# Altium project ADCS_Prototype.PrjPcb (part 1 of 2)
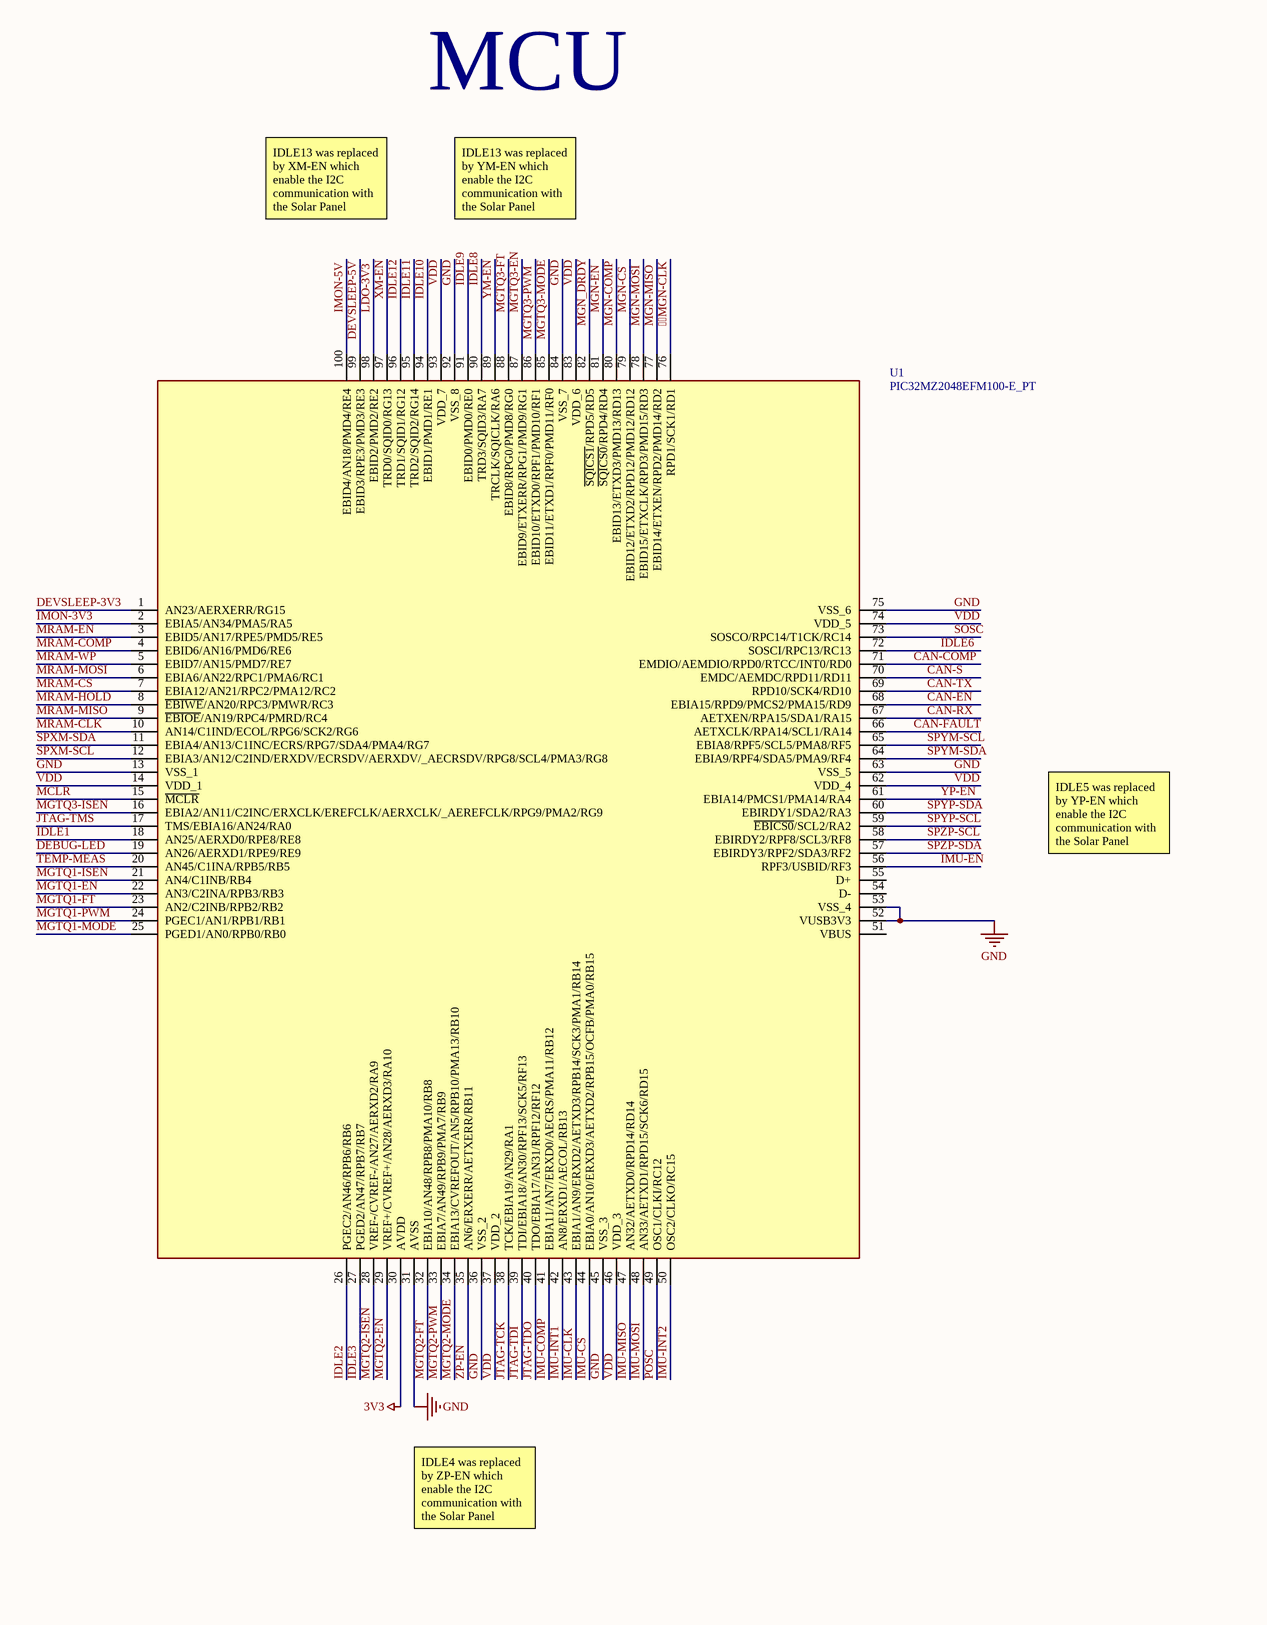
[diagram p0: Complete circuit.SchDoc, left]
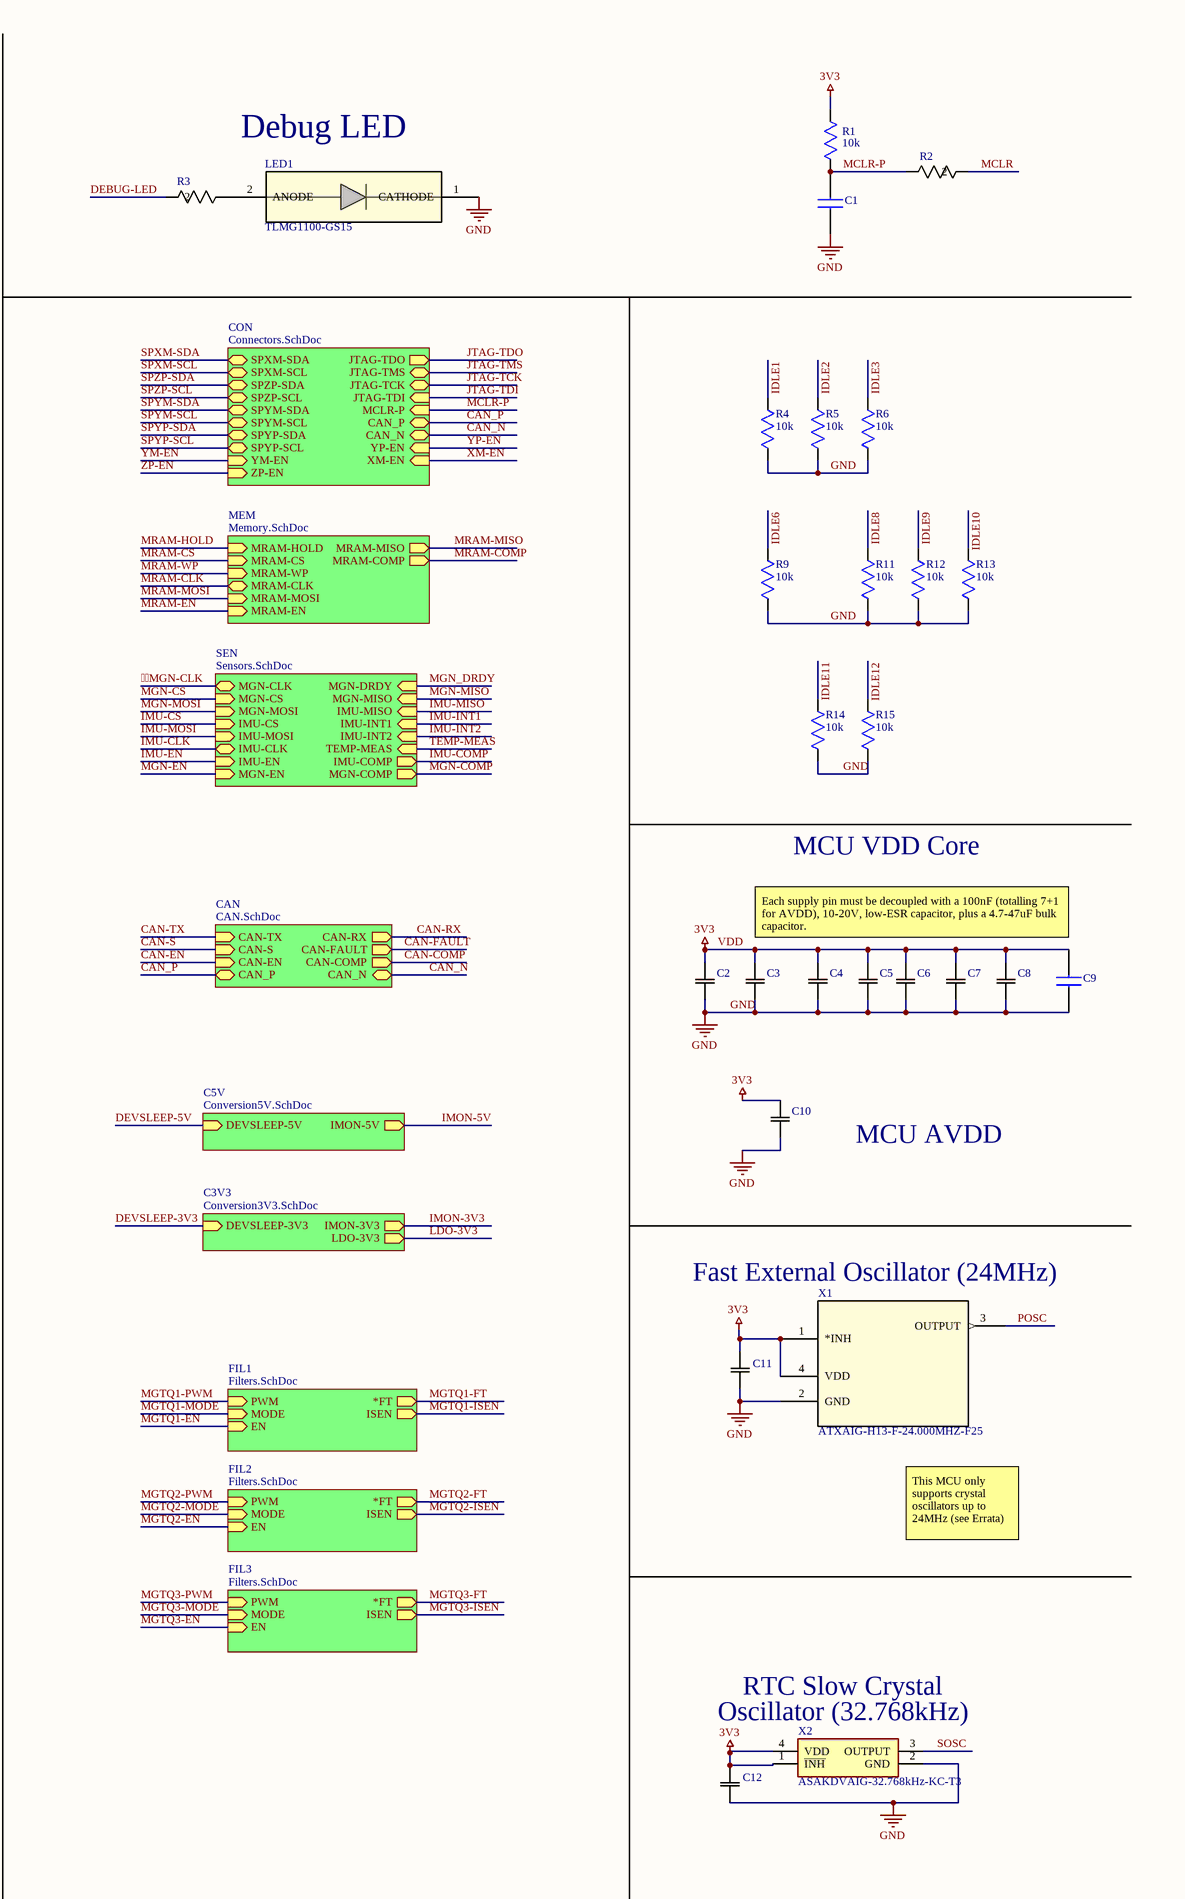
[diagram p1: Complete circuit.SchDoc, right]
9 sheets, 251 parts. Net scope: hierarchical (ports join the sheet entries above them; power ports are global).
Board file: Control_Board.PcbDoc
Sheets:
  Complete circuit.SchDoc
    FIL1 = Filters.SchDoc
    FIL2 = Filters.SchDoc
    FIL3 = Filters.SchDoc
    CAN = CAN.SchDoc
      CAN-CurrSense = CurrentSensing.SchDoc
    SEN = Sensors.SchDoc
      IMU-CurrSense = CurrentSensing.SchDoc
      MGN-CurrSense = CurrentSensing.SchDoc
    C5V = Conversion5V.SchDoc
    C3V3 = Conversion3V3.SchDoc
    CON = Connectors.SchDoc
    MEM = Memory.SchDoc
      MRAM-CurrSense = CurrentSensing.SchDoc

## Sheet Complete circuit.SchDoc
size A2; SheetNumber: 1; SheetTotal: 9

### Parts
C1  C1206C104K3GACAUTO  [CAPC3216X180N]  (value not drawn)
C2  C1206C104J4GACAUTO  [CAPC340180_180N_KEM]  (value not drawn)
C3  C1206C104J4GACAUTO  [CAPC340180_180N_KEM]  (value not drawn)
C4  C1206C104J4GACAUTO  [CAPC340180_180N_KEM]  (value not drawn)
C5  C1206C104J4GACAUTO  [CAPC340180_180N_KEM]  (value not drawn)
C6  C1206C104J4GACAUTO  [CAPC340180_180N_KEM]  (value not drawn)
C7  C1206C104J4GACAUTO  [CAPC340180_180N_KEM]  (value not drawn)
C8  C1206C104J4GACAUTO  [CAPC340180_180N_KEM]  (value not drawn)
C9  C0805X106K8RACAUTO7210  [CAPC2012X145N]  (value not drawn)
C10  C1206C104J4GACAUTO  [CAPC340180_180N_KEM]  (value not drawn)
C11  C0603X103F3GACAUTO  [CAPC17795_95N_KEM]  (value not drawn)
C12  C0603X103F3GACAUTO  [CAPC17795_95N_KEM]  (value not drawn)
LED1  TLMG1100-GS15  [LED_0603_VIS]
R1  value 10k  [RES_ERA3ARB103V]  (hidden comment: ERA3ARB103V)
R2  CRCW06031K00FKEA  [RES_CRCW_0603]  (value not drawn)
R3  MCT0603MD7502BP100  [RES_MCT_0603_VIS]  (value not drawn)
R4  value 10k  [RES_ERA3ARB103V]  (hidden comment: ERA3ARB103V)
R5  value 10k  [RES_ERA3ARB103V]  (hidden comment: ERA3ARB103V)
R6  value 10k  [RES_ERA3ARB103V]  (hidden comment: ERA3ARB103V)
R9  value 10k  [RES_ERA3ARB103V]  (hidden comment: ERA3ARB103V)
R11  value 10k  [RES_ERA3ARB103V]  (hidden comment: ERA3ARB103V)
R12  value 10k  [RES_ERA3ARB103V]  (hidden comment: ERA3ARB103V)
R13  value 10k  [RES_ERA3ARB103V]  (hidden comment: ERA3ARB103V)
R14  value 10k  [RES_ERA3ARB103V]  (hidden comment: ERA3ARB103V)
R15  value 10k  [RES_ERA3ARB103V]  (hidden comment: ERA3ARB103V)
U1  PIC32MZ2048EFM100-E_PT  [QFP40P1400X1400X120-100N]
X1  ATXAIG-H13-F-24.000MHZ-F25  [OSC4_ATXAIG-H13_ABR]
X2  ASAKDVAIG-32.768kHz-KC-T3  [ASAKDVAIG32768kHzKCT3]

### Sub-sheets
C3V3 = Conversion3V3.SchDoc: DEVSLEEP-3V3 (in), IMON-3V3 (out), LDO-3V3 (out)
C5V = Conversion5V.SchDoc: DEVSLEEP-5V (in), IMON-5V (out)
CAN = CAN.SchDoc: CAN-RX (out), CAN-FAULT (out), CAN-COMP (out), CAN-TX (in), CAN-S (in), CAN-EN (in), CAN_P (bidir), CAN_N (bidir)
CON = Connectors.SchDoc: SPXM-SDA (bidir), SPXM-SCL (bidir), SPZP-SDA (bidir), SPZP-SCL (bidir), SPYM-SDA (bidir), SPYM-SCL (bidir), SPYP-SDA (bidir), SPYP-SCL (bidir), JTAG-TDO (out), JTAG-TMS (bidir), JTAG-TCK (bidir), JTAG-TDI (in), MCLR-P (in), CAN_P (bidir), CAN_N (bidir), YP-EN (in), YM-EN (in), XM-EN (in), ZP-EN (in)
FIL1 = Filters.SchDoc: PWM (in), MODE (in), *FT (out), EN (in), ISEN (out)
FIL2 = Filters.SchDoc: PWM (in), MODE (in), *FT (out), EN (in), ISEN (out)
FIL3 = Filters.SchDoc: PWM (in), MODE (in), *FT (out), EN (in), ISEN (out)
MEM = Memory.SchDoc: MRAM-HOLD (in), MRAM-CS (in), MRAM-WP (in), MRAM-CLK (bidir), MRAM-MISO (out), MRAM-MOSI (in), MRAM-EN (in), MRAM-COMP (out)
SEN = Sensors.SchDoc: MGN-DRDY (in), MGN-CLK (bidir), MGN-MISO (in), MGN-CS (in), MGN-MOSI (in), IMU-MISO (in), IMU-CS (in), IMU-INT1 (in), IMU-MOSI (in), IMU-INT2 (in), IMU-CLK (bidir), TEMP-MEAS (in), IMU-EN (in), IMU-COMP (out), MGN-EN (in), MGN-COMP (out)

### Nets
GND: C1.2 C2.1 C3.1 C4.1 C5.1 C6.1 C7.1 C8.1 C9.1 C10.1 C11.1 C12.1 LED1.1(CATHODE) R4.1 R5.1 R6.1 R9.1 R11.1 R12.1 R13.1 R14.1 R15.1 U1.13(VSS_1) U1.31(AVSS) U1.36(VSS_2) U1.45(VSS_3) U1.52(VUSB3V3) U1.53(VSS_4) U1.63(VSS_5) U1.75(VSS_6) U1.84(VSS_7) U1.92(VSS_8) X1.2(GND) X2.2(GND)
VDD: C2.2 C3.2 C4.2 C5.2 C6.2 C7.2 C8.2 C9.2 C10.2 C11.2 C12.2 R1.2 U1.14(VDD_1) U1.30(AVDD) U1.37(VDD_2) U1.46(VDD_3) U1.62(VDD_4) U1.74(VDD_5) U1.83(VDD_6) U1.93(VDD_7) X1.1(*INH) X1.4(VDD) X2.1(~{INH}) X2.4(VDD)  [also labelled 3V3]
MGN-CLK: U1.76(RPD1/SCK1/RD1) ; sheet SEN/MGN-CLK
CAN-COMP: U1.71(EMDIO/AEMDIO/RPD0/RTCC/INT0/RD0) ; sheet CAN/CAN-COMP
CAN-EN: U1.68(EBIA15/RPD9/PMCS2/PMA15/RD9) ; sheet CAN/CAN-EN
CAN-FAULT: U1.66(AETXCLK/RPA14/SCL1/RA14) ; sheet CAN/CAN-FAULT
CAN-RX: U1.67(AETXEN/RPA15/SDA1/RA15) ; sheet CAN/CAN-RX
CAN-S: U1.70(EMDC/AEMDC/RPD11/RD11) ; sheet CAN/CAN-S
CAN-TX: U1.69(RPD10/SCK4/RD10) ; sheet CAN/CAN-TX
CAN_N: sheet CAN/CAN_N, sheet CON/CAN_N
CAN_P: sheet CAN/CAN_P, sheet CON/CAN_P
DEBUG-LED: R3.2 U1.19(AN26/AERXD1/RPE9/RE9)
DEVSLEEP-3V3: U1.1(AN23/AERXERR/RG15) ; sheet C3V3/DEVSLEEP-3V3
DEVSLEEP-5V: U1.99(EBID3/RPE3/PMD3/RE3) ; sheet C5V/DEVSLEEP-5V
IDLE1: R4.2 U1.18(AN25/AERXD0/RPE8/RE8)
IDLE2: R5.2 U1.26(PGEC2/AN46/RPB6/RB6)
IDLE3: R6.2 U1.27(PGED2/AN47/RPB7/RB7)
IDLE6: R9.2 U1.72(SOSCI/RPC13/RC13)
IDLE8: R11.2 U1.90(TRD3/SQID3/RA7)
IDLE9: R12.2 U1.91(EBID0/PMD0/RE0)
IDLE10: R13.2 U1.94(EBID1/PMD1/RE1)
IDLE11: R14.2 U1.95(TRD2/SQID2/RG14)
IDLE12: R15.2 U1.96(TRD1/SQID1/RG12)
IMON-3V3: U1.2(EBIA5/AN34/PMA5/RA5) ; sheet C3V3/IMON-3V3
IMON-5V: U1.100(EBID4/AN18/PMD4/RE4) ; sheet C5V/IMON-5V
IMU-CLK: U1.43(EBIA1/AN9/ERXD2/AETXD3/RPB14/SCK3/PMA1/RB14) ; sheet SEN/IMU-CLK
IMU-COMP: U1.41(EBIA11/AN7/ERXD0/AECRS/PMA11/RB12) ; sheet SEN/IMU-COMP
IMU-CS: U1.44(EBIA0/AN10/ERXD3/AETXD2/RPB15/OCFB/PMA0/RB15) ; sheet SEN/IMU-CS
IMU-EN: U1.56(RPF3/USBID/RF3) ; sheet SEN/IMU-EN
IMU-INT1: U1.42(AN8/ERXD1/AECOL/RB13) ; sheet SEN/IMU-INT1
IMU-INT2: U1.50(OSC2/CLKO/RC15) ; sheet SEN/IMU-INT2
IMU-MISO: U1.47(AN32/AETXD0/RPD14/RD14) ; sheet SEN/IMU-MISO
IMU-MOSI: U1.48(AN33/AETXD1/RPD15/SCK6/RD15) ; sheet SEN/IMU-MOSI
JTAG-TCK: U1.38(TCK/EBIA19/AN29/RA1) ; sheet CON/JTAG-TCK
JTAG-TDI: U1.39(TDI/EBIA18/AN30/RPF13/SCK5/RF13) ; sheet CON/JTAG-TDI
JTAG-TDO: U1.40(TDO/EBIA17/AN31/RPF12/RF12) ; sheet CON/JTAG-TDO
JTAG-TMS: U1.17(TMS/EBIA16/AN24/RA0) ; sheet CON/JTAG-TMS
LDO-3V3: U1.98(EBID2/PMD2/RE2) ; sheet C3V3/LDO-3V3
MCLR: R2.2 U1.15(~{MCLR})
MCLR-P: C1.1 R1.1 R2.1 ; sheet CON/MCLR-P
MGN-COMP: U1.80(EBID13/ETXD3/PMD13/RD13) ; sheet SEN/MGN-COMP
MGN-CS: U1.79(EBID12/ETXD2/RPD12/PMD12/RD12) ; sheet SEN/MGN-CS
MGN-EN: U1.81(~{SQICS0}/RPD4/RD4) ; sheet SEN/MGN-EN
MGN-MISO: U1.77(EBID14/ETXEN/RPD2/PMD14/RD2) ; sheet SEN/MGN-MISO
MGN-MOSI: U1.78(EBID15/ETXCLK/RPD3/PMD15/RD3) ; sheet SEN/MGN-MOSI
MGN_DRDY: U1.82(~{SQICS1}/RPD5/RD5) ; sheet SEN/MGN-DRDY
MGTQ1-EN: U1.22(AN3/C2INA/RPB3/RB3) ; sheet FIL1/EN
MGTQ1-FT: U1.23(AN2/C2INB/RPB2/RB2) ; sheet FIL1/*FT
MGTQ1-ISEN: U1.21(AN4/C1INB/RB4) ; sheet FIL1/ISEN  [project net ISEN_IFB]
MGTQ1-MODE: U1.25(PGED1/AN0/RPB0/RB0) ; sheet FIL1/MODE
MGTQ1-PWM: U1.24(PGEC1/AN1/RPB1/RB1) ; sheet FIL1/PWM
MGTQ2-EN: U1.29(VREF+/CVREF+/AN28/AERXD3/RA10) ; sheet FIL2/EN
MGTQ2-FT: U1.32(EBIA10/AN48/RPB8/PMA10/RB8) ; sheet FIL2/*FT
MGTQ2-ISEN: U1.28(VREF-/CVREF-/AN27/AERXD2/RA9) ; sheet FIL2/ISEN  [project net ISEN_IFB]
MGTQ2-MODE: U1.34(EBIA13/CVREFOUT/AN5/RPB10/PMA13/RB10) ; sheet FIL2/MODE
MGTQ2-PWM: U1.33(EBIA7/AN49/RPB9/PMA7/RB9) ; sheet FIL2/PWM
MGTQ3-EN: U1.87(EBID9/ETXERR/RPG1/PMD9/RG1) ; sheet FIL3/EN
MGTQ3-FT: U1.88(EBID8/RPG0/PMD8/RG0) ; sheet FIL3/*FT
MGTQ3-ISEN: U1.16(EBIA2/AN11/C2INC/ERXCLK/EREFCLK/AERXCLK/_AEREFCLK/RPG9/PMA2/RG9) ; sheet FIL3/ISEN  [project net ISEN_IFB]
MGTQ3-MODE: U1.85(EBID11/ETXD1/RPF0/PMD11/RF0) ; sheet FIL3/MODE
MGTQ3-PWM: U1.86(EBID10/ETXD0/RPF1/PMD10/RF1) ; sheet FIL3/PWM
MRAM-CLK: U1.10(AN14/C1IND/ECOL/RPG6/SCK2/RG6) ; sheet MEM/MRAM-CLK
MRAM-COMP: U1.4(EBID6/AN16/PMD6/RE6) ; sheet MEM/MRAM-COMP
MRAM-CS: U1.7(EBIA12/AN21/RPC2/PMA12/RC2) ; sheet MEM/MRAM-CS
MRAM-EN: U1.3(EBID5/AN17/RPE5/PMD5/RE5) ; sheet MEM/MRAM-EN
MRAM-HOLD: U1.8(~{EBIWE}/AN20/RPC3/PMWR/RC3) ; sheet MEM/MRAM-HOLD
MRAM-MISO: U1.9(~{EBIOE}/AN19/RPC4/PMRD/RC4) ; sheet MEM/MRAM-MISO
MRAM-MOSI: U1.6(EBIA6/AN22/RPC1/PMA6/RC1) ; sheet MEM/MRAM-MOSI
MRAM-WP: U1.5(EBID7/AN15/PMD7/RE7) ; sheet MEM/MRAM-WP
POSC: U1.49(OSC1/CLKI/RC12) X1.3(OUTPUT)
SOSC: U1.73(SOSCO/RPC14/T1CK/RC14) X2.3(OUTPUT)
SPXM-SCL: U1.12(EBIA3/AN12/C2IND/ERXDV/ECRSDV/AERXDV/_AECRSDV/RPG8/SCL4/PMA3/RG8) ; sheet CON/SPXM-SCL
SPXM-SDA: U1.11(EBIA4/AN13/C1INC/ECRS/RPG7/SDA4/PMA4/RG7) ; sheet CON/SPXM-SDA
SPYM-SCL: U1.65(EBIA8/RPF5/SCL5/PMA8/RF5) ; sheet CON/SPYM-SCL
SPYM-SDA: U1.64(EBIA9/RPF4/SDA5/PMA9/RF4) ; sheet CON/SPYM-SDA
SPYP-SCL: U1.59(~{EBICS0}/SCL2/RA2) ; sheet CON/SPYP-SCL
SPYP-SDA: U1.60(EBIRDY1/SDA2/RA3) ; sheet CON/SPYP-SDA
SPZP-SCL: U1.58(EBIRDY2/RPF8/SCL3/RF8) ; sheet CON/SPZP-SCL
SPZP-SDA: U1.57(EBIRDY3/RPF2/SDA3/RF2) ; sheet CON/SPZP-SDA
TEMP-MEAS: U1.20(AN45/C1INA/RPB5/RB5) ; sheet SEN/TEMP-MEAS
XM-EN: U1.97(TRD0/SQID0/RG13) ; sheet CON/XM-EN
YM-EN: U1.89(TRCLK/SQICLK/RA6) ; sheet CON/YM-EN
YP-EN: U1.61(EBIA14/PMCS1/PMA14/RA4) ; sheet CON/YP-EN
ZP-EN: U1.35(AN6/ERXERR/AETXERR/RB11) ; sheet CON/ZP-EN
NetLED1_2: LED1.2(ANODE) R3.1

Not connected (* = marked no-connect by the designer): U1 51(VBUS) 54(D-) 55(D+)

### Notes on the sheet
- Debug LED
- MCU
- IDLE13 was replaced by XM-EN which enable the I2C communication with the Solar Panel
- IDLE13 was replaced by YM-EN which enable the I2C communication with the Solar Panel
- IDLE5 was replaced by YP-EN which enable the I2C communication with the Solar Panel
- MCU VDD Core
- Each supply pin must be decoupled with a 100nF (totalling 7+1 for AVDD), 10-20V, low-ESR capacitor, plus a 4.7-47uF bulk capacitor.
- MCU AVDD
- (near X1) Fast External Oscillator (24MHz)
- IDLE4 was replaced by ZP-EN which enable the I2C communication with the Solar Panel
- This MCU only supports crystal oscillators up to 24MHz (see Errata)
- (near X2) Oscillator (32.768kHz)
- RTC Slow Crystal

### Library data of the parts
C1 = CMP-001-00115-2: SMD Auto C0G, Ceramic, 0.1 uF, 10%, 25 VDC, 62.5 VDC, 125C, -55C, C0G, SMD, MLCC, Ultra-Stable, Low Loss, Automotive Grade, 0.1 % , 10 GOhms, 36 mg, 1206, 3.2mm, 1.6mm, 1.6mm, 0.5mm, 2000, 78  Weeks, 120; Manufacturer_Name: KEMET; Geometry.Height: 1.8mm; Datasheet Link: https://content.kemet.com/datasheets/KEM_C1022_C0G_AUTO_SMD.pdf; Design Item ID: C1206C104K3GACAUTO; Manufacturer_Part_Number: C1206C104K3GACAUTO; Mouser Part Number: 80-C1206C104K3GAUTO; Mouser Price/Stock: https://www.mouser.co.uk/ProductDetail/KEMET/C1206C104K3GACAUTO?qs=iLbezkQI%252BsiL409OZdKKSA%3D%3D; Source: C1206C104K3GACAUTO.SchLib
C2-C8 C10 = CMP-001-00131-4: SMD Auto C0G, Ceramic, 0.1 uF, 5%, 16 VDC, C0G, SMD, MLCC, Ultra-Stable, Low Loss, Automotive Grade, 1206; Manufacturer_Name: Kemet; Copyright: Copyright (C) 2025 Ultra Librarian. All rights reserved.; Manufacturer_Part_Number: C1206C104J4GACAUTO; Source: C1206C104J4GACAUTO.SchLib; Design Item ID: C1206C104J4GACAUTO
C9 = CMP-001-00121-2: SMD Auto X7R Flex, Ceramic, 10 uF, 10%, 10 VDC, 25 VDC, 125C, -55C, X7R, SMD, MLCC, FT-CAP, Automotive Grade, 10 % , 10 MOhms, 21 mg, 0805, 2mm, 1.25mm, 1.25mm, 0.75mm, 0.5mm, 10000, 78  Weeks, 80; Manufacturer_Name: YAGEO; Geometry.Height: 1.45mm; Capacitance: 10uF; Mouser Price/Stock: https://www.mouser.co.uk/ProductDetail/KEMET/C0805X106K8RACAUTO7210?qs=HXFqYaX1Q2whBpVr4Bdd3g%3D%3D; Mouser Part Number: 80-C0805X106K8RAUTLR; Source: C0805X106K8RACAUTO7210.SchLib; Design Item ID: C0805X106K8RACAUTO7210; Datasheet Link: https://content.kemet.com/datasheets/KEM_C1078_X7R_FT-CAP_AUTO_SMD.pdf; Manufacturer_Part_Number: C0805X106K8RACAUTO7210
C11 C12 = CMP-001-00116-2: SMD Auto C0G Flex, Ceramic, 0.01 uF, 1%, 25 VDC, C0G, SMD, MLCC, FT-CAP, Ultra-Stable, Automotive Grade, 0603; Manufacturer_Name: Kemet; Copyright: Copyright (C) 2025 Ultra Librarian. All rights reserved.; Design Item ID: C0603X103F3GACAUTO; Manufacturer_Part_Number: C0603X103F3GACAUTO; Source: C0603X103F3GACAUTO.SchLib
LED1 = CMP-007-00036-1: CHIPLED(SMD 0603-LED) GREEN U.BRIGHT-e4; Manufacturer_Name: Vishay; RefDes: RefDes; Copyright: Copyright (C) 2025 Ultra Librarian. All rights reserved.; Type: Type; Design Item ID: TLMG1100-GS15; Manufacturer_Part_Number: TLMG1100-GS15; Source: TLMG1100-GS15.SchLib
R1 R4-R6 R9 R11-R15 = CMP-009-00245-3: Thin Film Resistors - SMD 0603 10Kohm 0.1% 10ppm AEC-Q200; Design Item ID: ERA3ARB103V; Case/Package: None; Pins: 2; Source: ERA3ARB103V.SchLib; Component Type: Standard; MP: ERA3ARB103V; Availability: Unavailable; Price: None
R2 = CMP-009-00227-2: D11/CRCW0603 100 1K 1% ET1 e3; Manufacturer_Name: Vishay; Source: CRCW06031K00FKEA.SchLib; Copyright: Copyright (C) 2026 Ultra Librarian. All rights reserved.; Design Item ID: CRCW06031K00FKEA; Manufacturer_Part_Number: CRCW06031K00FKEA
R3 = CMP-009-00216-2: MCT 0603-25 0.1% AT P1 75K; Manufacturer_Name: Vishay; Source: MCT0603MD7502BP100.SchLib; Copyright: Copyright (C) 2025 Ultra Librarian. All rights reserved.; Design Item ID: MCT0603MD7502BP100; Manufacturer_Part_Number: MCT0603MD7502BP100
U1 = CMP-481-000000-2: 32-bit Microcontrollers - MCU 32-Bit MCU 2048KB FL 512KB RAM Crypto; Manufacturer_Part_Number: PIC32MZ2048EFM100-E/PT; Manufacturer_Name: Microchip; Geometry.Height: 1.2mm; Source: PIC32MZ2048EFM100-E_PT.SchLib; Mouser Part Number: 579-MZ2048EFM100EPT; Design Item ID: PIC32MZ2048EFM100-E_PT; Datasheet Link: https://componentsearchengine.com/Datasheets/1/PIC32MZ2048EFM100-E_PT.pdf; Mouser Price/Stock: https://www.mouser.co.uk/ProductDetail/Microchip-Technology/PIC32MZ2048EFM100-E-PT?qs=r%2FmwOkjQ8utAqJN2CglPVg%3D%3D
X1 = CMP-337-000000-2: 24 MHz TCXO CMOS Oscillator 1.68V ~ 3.63V Enable/Disable 4-SMD, No Lead; Manufacturer_Name: Abracon; Copyright: Copyright (C) 2026 Ultra Librarian. All rights reserved.; Manufacturer_Part_Number: ATXAIG-H13-F-40.000MHZ-F25; RefDes: RefDes; Source: ATXAIG-H13-F-40P000MHZ-F25.SchLib; Type: Oscillators; Design Item ID: ATXAIG-H13-F-40.000MHZ-F25
X2 = CMP-003-00035-1: XTAL OSC XO Continuous Volt kHz Automotive; Manufacturer_Name: ABRACON; Geometry.Height: 0.8mm; Datasheet Link: https://abracon.com/datasheets/ASAKDVAIG.pdf; Manufacturer_Part_Number: ASAKDVAIG-32.768kHz-KC-T3; Design Item ID: ASAKDVAIG-32.768kHz-KC-T3; Mouser Part Number: 815-AKDVAIG32768KCT3; Source: ASAKDVAIG-32.768kHz-KC-T3.SchLib; Mouser Price/Stock: https://www.mouser.co.uk/ProductDetail/ABRACON/ASAKDVAIG-32.768kHz-KC-T3?qs=vvQtp7zwQdM6CQP0VQ4oog%3D%3D

## Sheet Filters.SchDoc
size A4; SheetNumber: 4; SheetTotal: 9
Used 3 times, as channels FIL1, FIL2, FIL3. Parts and nets are listed once, with the designators drawn on the sheet.
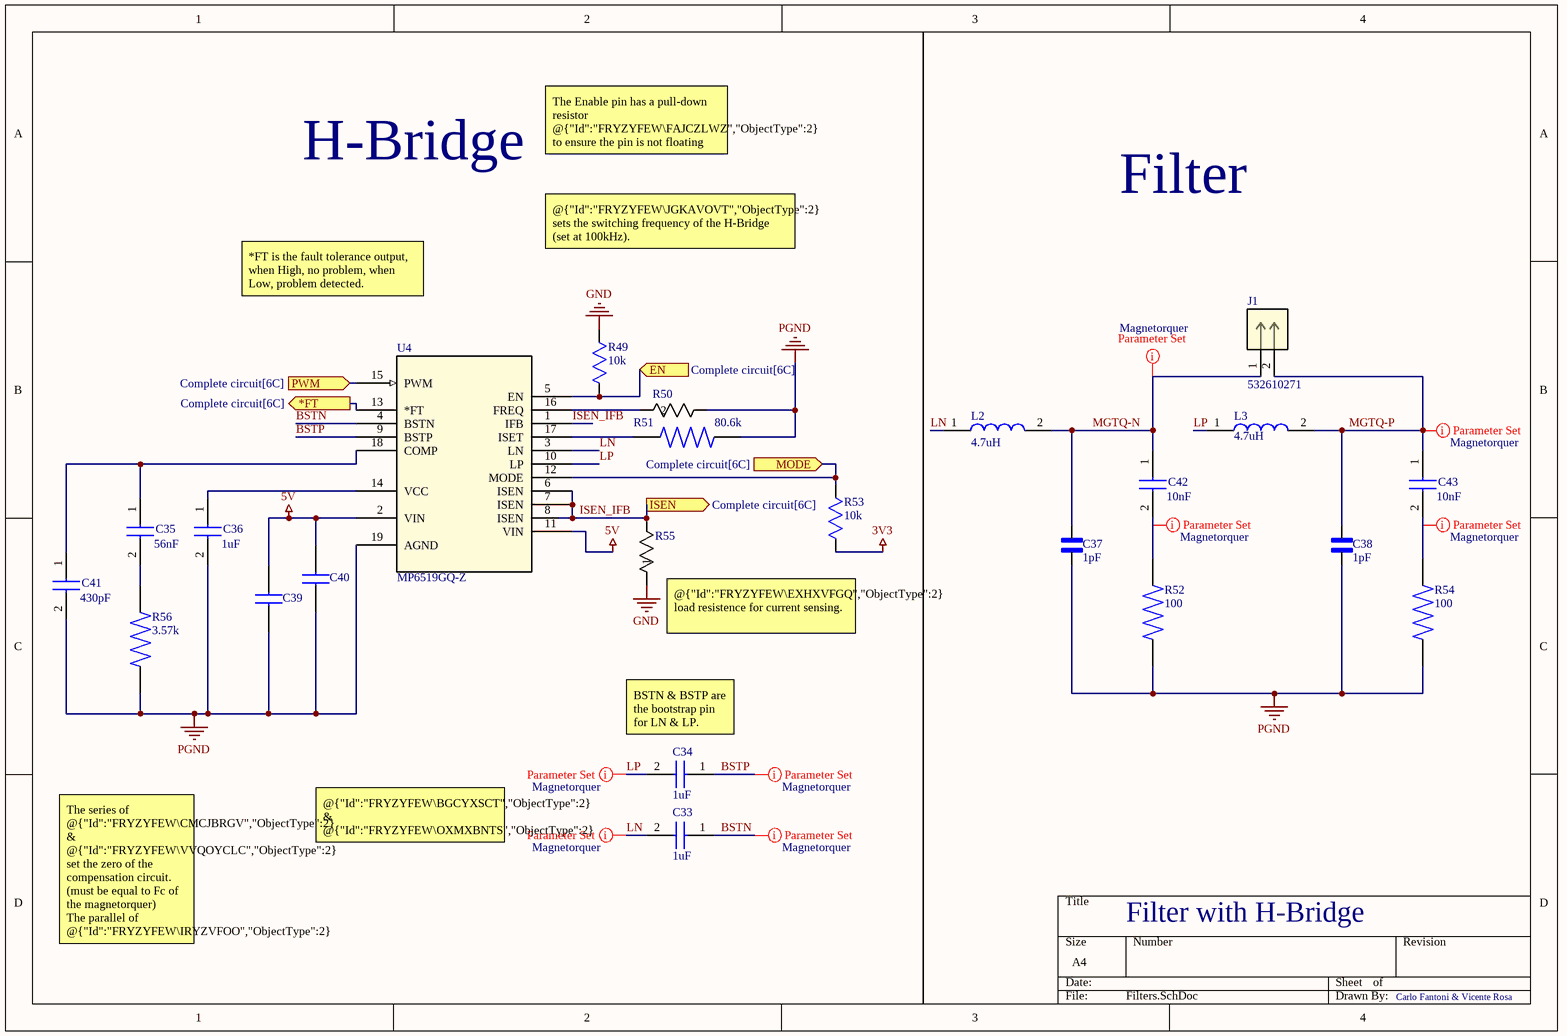
[diagram p2: Filters.SchDoc]

### Parts
C33  Capacitance: 1uF  [C0603]  (hidden comment: C0603X105K4RACAUTO7411)
C34  Capacitance: 1uF  [C0603]  (hidden comment: C0603X105K4RACAUTO7411)
C35  Capacitance: 56nF  [GCM31C5C2E183FX03L]  (hidden comment: GCM31M5C1H563GA16L)
C36  Capacitance: 1uF  [C0603]  (hidden comment: C0603X105K4RACAUTO7411)
C37  value 1pF  [CAPC1608X90]  (hidden comment: AC0603BRNPO9BN1R0)
C38  value 1pF  [CAPC1608X90]  (hidden comment: AC0603BRNPO9BN1R0)
C39  GCM31CR71A226KE02L  [CAPC3116X180N]  (value not drawn)
C40  GCM31CR71A226KE02L  [CAPC3116X180N]  (value not drawn)
C41  Capacitance: 430pF  [CAPC1608X90N]  (hidden comment: 06035C431JAT2A)
C42  Capacitance: 10nF  [CAPC1608X90N]  (hidden comment: 0603ZC103M4T2A)
C43  Capacitance: 10nF  [CAPC1608X90N]  (hidden comment: 0603ZC103M4T2A)
J1  532610271  [CONN_532610001-SD_02_MOL]
L2  Inductance: 4.7uH  [LQM2MPN1R0NG0L]  (hidden comment: LQM2MPZ4R7MG0L)
L3  Inductance: 4.7uH  [LQM2MPN1R0NG0L]  (hidden comment: LQM2MPZ4R7MG0L)
R49  value 10k  [RES_ERA3ARB103V]  (hidden comment: ERA3ARB103V)
R50  ERJ-6ENF2260V  [RC0805N_PAN]  (value not drawn)
R51  value 80.6k  [RES_ERJ3EKF8062V]  (hidden comment: ERJ3EKF8062V)
R52  value 100  [RESC2012X60N]  (hidden comment: CRCW0805100RFKEAHP)
R53  value 10k  [RES_ERA3ARB103V]  (hidden comment: ERA3ARB103V)
R54  value 100  [RESC2012X60N]  (hidden comment: CRCW0805100RFKEAHP)
R55  KDV06FR100ET  [RES_KDV06_OHM]  (value not drawn)
R56  value 3.57k  [RES_ERJPA3F3571V]  (hidden comment: ERJPA3F3571V)
U4  MP6519GQ-Z  [QFN-3x3_MP6519_MNP]

### Ports
*FT (out, see Complete circuit[6C]), EN (in, see Complete circuit[6C]), ISEN (out, see Complete circuit[6C]), MODE (in, see Complete circuit[6C]), PWM (in, see Complete circuit[6C])

### Nets
3V3: R53.1
5V: C39.2 C40.2 U4.2(VIN) U4.11(VIN)
GND: R49.2 R55.1
PGND: C36.2 C37.2 C38.2 C39.1 C40.1 C41.2 R50.1 R51.2 R52.1 R54.1 R56.1 U4.19(AGND)
*FT: U4.13(*FT) ; port *FT
BSTN: C33.1 U4.4(BSTN)
BSTP: C34.1 U4.9(BSTP)
EN: R49.1 U4.5(EN) ; port EN
ISEN_IFB: R55.2 U4.1(IFB) U4.6(ISEN) U4.7(ISEN) U4.8(ISEN) ; port ISEN
LN: C33.2 L2.1 U4.3(LN)
LP: C34.2 L3.1 U4.10(LP)
MGTQ-N: C37.1 C42.1 J1.1 L2.2
MGTQ-P: C38.1 C43.1 J1.2 L3.2
MODE: R53.2 U4.12(MODE) ; port MODE
PWM: U4.15(PWM) ; port PWM
NetC35_1: C35.1 C41.1 U4.18(COMP)
NetC35_2: C35.2 R56.2
NetC36_1: C36.1 U4.14(VCC)
NetC42_2: C42.2 R52.2
NetC43_2: C43.2 R54.2
NetR50_2: R50.2 U4.16(FREQ)
NetR51_1: R51.1 U4.17(ISET)

### Channels
FIL1: designators end in A; ports *FT=MGTQ1-FT EN=MGTQ1-EN ISEN=ISEN_IFB MODE=MGTQ1-MODE PWM=MGTQ1-PWM
FIL2: designators end in B; ports *FT=MGTQ2-FT EN=MGTQ2-EN ISEN=ISEN_IFB MODE=MGTQ2-MODE PWM=MGTQ2-PWM
FIL3: designators end in C; ports *FT=MGTQ3-FT EN=MGTQ3-EN ISEN=ISEN_IFB MODE=MGTQ3-MODE PWM=MGTQ3-PWM

### Layout directives
net class Magnetorquer: BSTN_FIL1, BSTP_FIL1, LN_FIL1, LP_FIL1, MGTQ-N_FIL1, MGTQ-P_FIL1, NetC42A_2, NetC43A_2

### Notes on the sheet
- H-Bridge
- The Enable pin has a pull-down resistor @{"Id":"FRYZYFEW\FAJCZLWZ","ObjectType":2} to ensure the pin is not floating and control the functioning.
- @{"Id":"FRYZYFEW\JGKAVOVT","ObjectType":2} sets the switching frequency of the H-Bridge (set at 100kHz).
  @{"Id":"FRYZYFEW\IHANNGST","ObjectType":2} sets the maximum output current (1.1A).
- Filter
- *FT is the fault tolerance output, when High, no problem, when Low, problem detected.
- (near R55) @{"Id":"FRYZYFEW\EXHXVFGQ","ObjectType":2} load resistence for current sensing.
- (near C34) BSTN & BSTP are the bootstrap pin for LN & LP.
- @{"Id":"FRYZYFEW\BGCYXSCT","ObjectType":2} & @{"Id":"FRYZYFEW\OXMXBNTS","ObjectType":2} decoupling capacitors for VIN.
  @{"Id":"FRYZYFEW\CWQAZVTG","ObjectType":2} same function for VCC.
- Filter with H-Bridge
- The series of @{"Id":"FRYZYFEW\CMCJBRGV","ObjectType":2} & @{"Id":"FRYZYFEW\VVQOYCLC","ObjectType":2} set the zero of the compensation circuit. (must be equal to Fc of the magnetorquer)
  The parallel of @{"Id":"FRYZYFEW\IRYZVFOO","ObjectType":2} and ( @{"Id":"FRYZYFEW\CMCJBRGV","ObjectType":2} & @{"Id":"FRYZYFEW\VVQOYCLC","ObjectType":2} ) gives the pole, that must equal the switching frequency.
- Carlo Fantoni & Vicente Rosa

### Library data of the parts
C33 C34 C36 = C0603X105K4RACAUTO7411: Multilayer Ceramic Capacitors MLCC - SMD/SMT 16 Vol 1 uF 0603 X7R 10 % AECQ200; Manufacturer_Name: Yageo Group; Datasheet Link: https://content.kemet.com/datasheets/KEM_C1078_X7R_FT-CAP_AUTO_SMD.pdf; Height: 0.87mm; Manufacturer_Part_Number: C0603X105K4RACAUTO7411; Mouser Part Number: 80-C0603X105K4RAUTLR; Mouser Price/Stock: https://www.mouser.co.uk/ProductDetail/KEMET/C0603X105K4RACAUTO7411?qs=55YtniHzbhCFXoL%252B6qNZhA%3D%3D; Arrow Part Number: C0603X105K4RACAUTO7411; Arrow Price/Stock: https://www.arrow.com/en/products/c0603x105k4racauto7411/kemet-corporation
C35 = GCM31M5C1H563GA16L: Multilayer Ceramic Capacitors MLCC - SMD/SMT 0.056 uF 50 VDC 2% 1206 C0G (NP0) AEC-Q200; Manufacturer_Name: Murata Electronics; Datasheet Link: https://search.murata.co.jp/Ceramy/image/img/A01X/G101/ENG/GCM31M5C1H563GA16-01A.pdf; Height: 1.25mm; Manufacturer_Part_Number: GCM31M5C1H563GA16L; Mouser Part Number: 81-GCM31M5C1H563GA6L; Mouser Price/Stock: https://www.mouser.co.uk/ProductDetail/Murata-Electronics/GCM31M5C1H563GA16L?qs=QzBtWTOodeXHyUqaFogeLg%3D%3D
C37 C38 = CMP-001-00134-1: 1 pF Â±0.1pF 50V Ceramic Capacitor C0G, NP0 0603 (1608 Metric); MF: Yageo; Check_prices: https://www.snapeda.com/parts/AC0603BRNPO9BN1R0/Yageo/view-part/?ref=eda; Component Type: Standard; SnapEDA_Link: https://www.snapeda.com/parts/AC0603BRNPO9BN1R0/Yageo/view-part/?ref=snap; Case/Package: 0603 Yageo; MP: AC0603BRNPO9BN1R0; Design Item ID: AC0603BRNPO9BN1R0; Source: AC0603BRNPO9BN1R0.SchLib; Pins: 2
C39 C40 = CMP-001-00127-1: Capacitor GCM31 L=3.2mm W=1.6mm T=1.6mm; Manufacturer_Name: Murata Electronics; Geometry.Height: 1.8mm; Mouser Price/Stock: https://www.mouser.co.uk/ProductDetail/Murata-Electronics/GCM31CR71A226KE02L?qs=9UHcxq0qN4vtutbd1jidnA%3D%3D; Source: GCM31CR71A226KE02L.SchLib; Datasheet Link: https://search.murata.co.jp/Ceramy/image/img/A01X/G101/ENG/GCM31CR71A226KE02-01A.pdf; Design Item ID: GCM31CR71A226KE02L; Manufacturer_Part_Number: GCM31CR71A226KE02L; Mouser Part Number: 81-GCM31CR71A226KE2L
C41 = 06035C431JAT2A: 430 pF Â±5% 50V Ceramic Capacitor X7R 0603 (1608 Metric); Manufacturer_Name: Kyocera AVX; Datasheet Link: https://componentsearchengine.com/Datasheets/1/06031A100FAT2A.pdf; Height: 0.9mm; Manufacturer_Part_Number: 06035C431JAT2A; Mouser Part Number: 581-06035C431JAT2A; Mouser Price/Stock: https://www.mouser.co.uk/ProductDetail/AVX/06035C431JAT2A?qs=qVfB0%2FDaMDZVRmf5AEZuTw%3D%3D
C42 C43 = 0603ZC103M4T2A: Capacitor; Manufacturer_Name: Kyocera AVX; Datasheet Link: https://componentsearchengine.com/Datasheets/1/06031A100FAT2A.pdf; Height: 0.9mm; Manufacturer_Part_Number: 0603ZC103M4T2A; Mouser Part Number: 581-0603ZC103M4T2A; Mouser Price/Stock: https://www.mouser.com/Search/Refine.aspx?Keyword=581-0603ZC103M4T2A
J1 = 532610271: 1.25mm Pitch, PicoBlade PCB Header, Single Row, Right-Angle, Surface Mount, Tin (Sn) Plating, Friction Lock, 2 Circuits, Natural, Tape and Reel; Manufacturer_Name: Molex Connector Corporation; Copyright: Copyright (C) 2025 Ultra Librarian. All rights reserved.; Manufacturer_Part_Number: 532610271; RefDes: RefDes; Type: Type
L2 L3 = LQM2MPZ4R7MG0L: FIXED IND 4.7UH 1.1A 175 MOHM; Manufacturer_Name: Murata Electronics; Datasheet Link: https://search.murata.co.jp/Ceramy/image/img/P02/JELF243B-9109.pdf; Height: 1mm; Manufacturer_Part_Number: LQM2MPZ4R7MG0L; Mouser Part Number: 81-LQM2MPZ4R7MG0L; Mouser Price/Stock: https://www.mouser.com/Search/Refine.aspx?Keyword=81-LQM2MPZ4R7MG0L
R49 R53 = CMP-009-00245-3: as R1 on sheet Complete circuit; Design Item ID: ERA3ARB103V; Case/Package: None; Pins: 2; Source: ERA3ARB103V.SchLib; Component Type: Standard; MP: ERA3ARB103V; Availability: Unavailable; Price: None
R50 = ERJ-6ENF2260V: No Description Available; Manufacturer_Name: Panasonic; Copyright: Copyright (C) 2026 Ultra Librarian. All rights reserved.; Manufacturer_Part_Number: ERJ-6ENF2260V
R51 = CMP-009-00255-1: 80.6 kOhms 1% 0.1W, 1/10W Chip Resistor 0603 (1608 Metric) Automotive AEC-Q200 Thick Film; MF: Panasonic; MP: ERJ-3EKF8062V; SnapEDA_Link: https://www.snapeda.com/parts/ERJ-3EKF8062V/Panasonic+Electronic+Components/view-part/?ref=snap; Design Item ID: ERJ3EKF8062V; Case/Package: 1608-2 Panasonic; Pins: 2; Component Type: Standard; Source: ERJ3EKF8062V.SchLib; Check_prices: https://www.snapeda.com/parts/ERJ-3EKF8062V/Panasonic+Electronic+Components/view-part/?ref=eda
R52 R54 = CMP-009-00256-1: Resistor;Thick Film;100 Ohms;0.33 W;1%;SMT;0805;TCR 37 ppm/DegC; MF: Vishay; Design Item ID: CRCW0805100RFKEAHP; Component Type: Standard; MP: CRCW0805100RFKEAHP; Check_prices: https://www.snapeda.com/parts/CRCW0805100RFKEAHP/Vishay+Dale/view-part/?ref=eda; SnapEDA_Link: https://www.snapeda.com/parts/CRCW0805100RFKEAHP/Vishay+Dale/view-part/?ref=snap; Pins: 2; Source: CRCW0805100RFKEAHP.SchLib; Case/Package: 2012 Bourns
R55 = KDV06FR100ET: No Description Available; Manufacturer_Name: Ohmite; Copyright: Copyright (C) 2026 Ultra Librarian. All rights reserved.; Manufacturer_Part_Number: KDV06FR100ET
R56 = CMP-009-00253-1: RES SMD 3.57K OHM 1% 1/4W 0603; MP: ERJ-PA3F3571V; MF: Panasonic; Design Item ID: ERJPA3F3571V; Check_prices: https://www.snapeda.com/parts/ERJ-PA3F3571V/Panasonic/view-part/?ref=eda; Component Type: Standard; SnapEDA_Link: https://www.snapeda.com/parts/ERJ-PA3F3571V/Panasonic/view-part/?ref=snap; Source: ERJPA3F3571V.SchLib; Case/Package: 1608-2 Panasonic; Pins: 2
U4 = MP6519GQ-Z: 2.5V - 28V 5A H-Bridge Current Regulator; Manufacturer_Name: Monolithic Power Systems; Copyright: Copyright (C) 2026 Ultra Librarian. All rights reserved.; Manufacturer_Part_Number: MP6519GQ-Z; RefDes: RefDes; Type: Type

## Sheet CAN.SchDoc
size A4; SheetNumber: 6; SheetTotal: 9
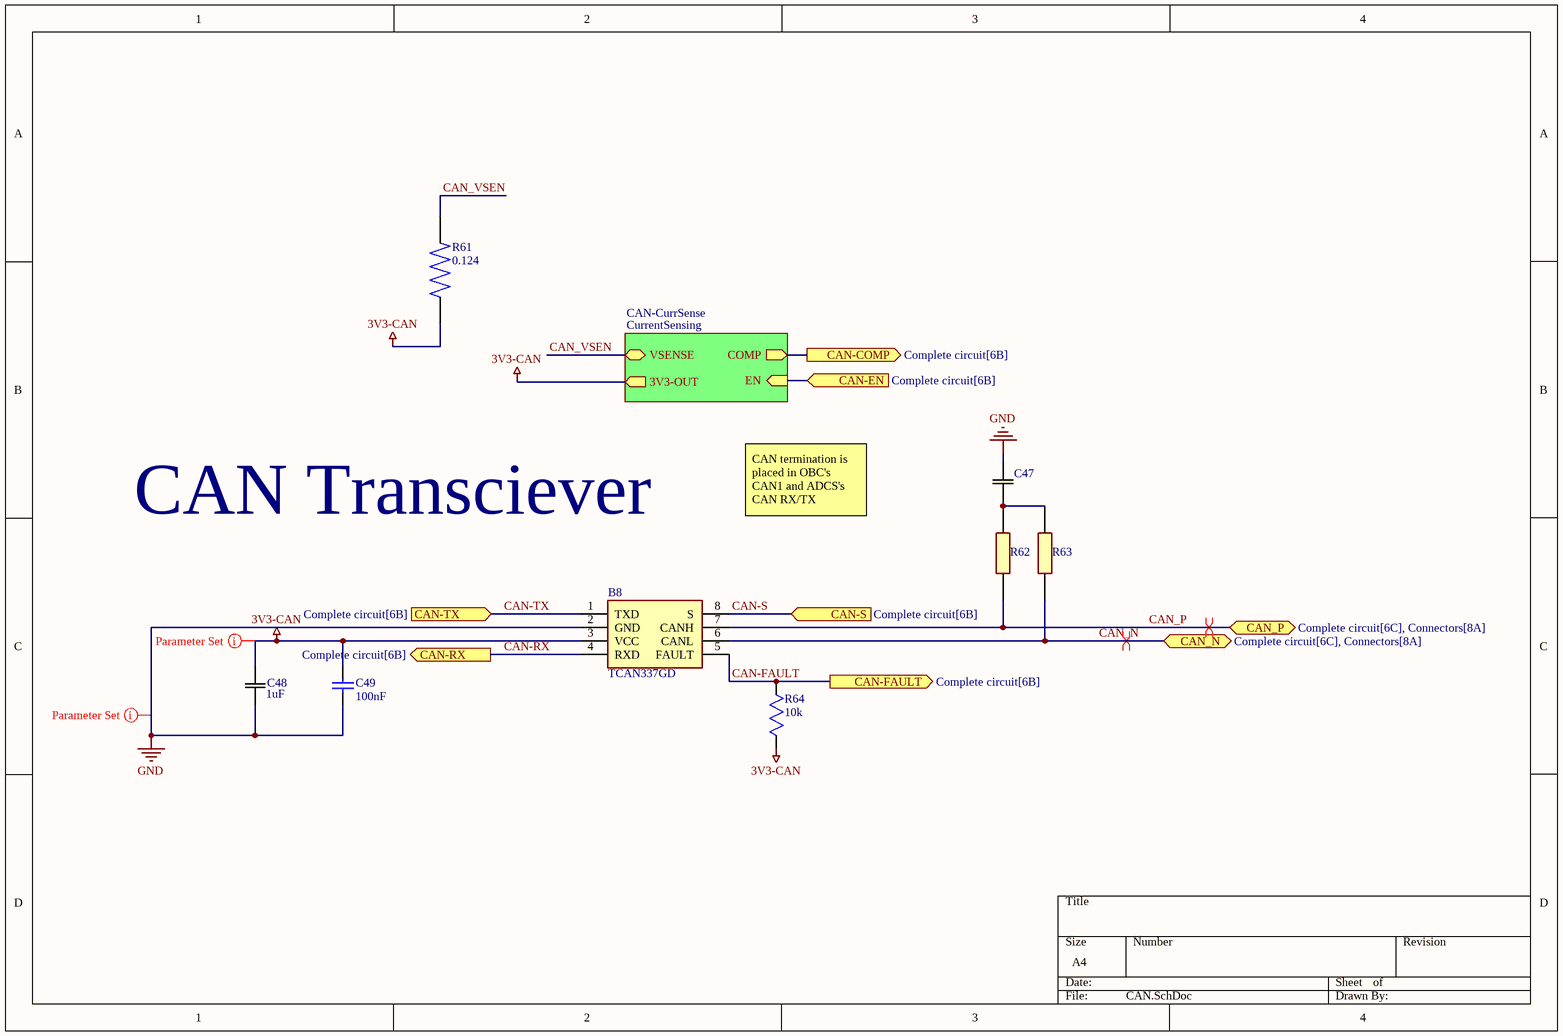
[diagram p3: CAN.SchDoc]

### Parts
B8  TCAN337GD  [SOIC127P600X175-8N]
C47  C0603C472F3GECAUTO  [CAPC17595_87N_KEM]  (value not drawn)
C48  Capacitance: 1uF  [CAPC18095_95N_KEM]  (hidden comment: C0603X105J4RACAUTO)
C49  value 100nF  [CAPC1608X87X45LL20T05]  (hidden comment: C0603X104J4RACTU)
R61  value 0.124  [RESC1608X55N]  (hidden comment: SR731JTTDR124F)
R62  P0603Y60R0BBT  [RESC1508X63N]  (value not drawn)
R63  P0603Y60R0BBT  [RESC1508X63N]  (value not drawn)
R64  value 10k  [RES_ERA3ARB103V]  (hidden comment: ERA3ARB103V)

### Sub-sheets
CAN-CurrSense = CurrentSensing: COMP (out), EN (in), 3V3-OUT (out), VSENSE (bidir)

### Ports
CAN-COMP (out, see Complete circuit[6B]), CAN-EN (in, see Complete circuit[6B]), CAN-FAULT (out, see Complete circuit[6B]), CAN-RX (out, see Complete circuit[6B]), CAN-S (in, see Complete circuit[6B]), CAN-TX (in, see Complete circuit[6B]), CAN_N (bidir, see Complete circuit[6C], Connectors[8A]), CAN_P (bidir, see Complete circuit[6C], Connectors[8A])

### Nets
3V3-CAN: B8.3(VCC) C48.2 C49.1 R61.1 R64.1 ; sheet CAN-CurrSense/3V3-OUT
GND: B8.2(GND) C47.2 C48.1 C49.2
CAN-COMP: port CAN-COMP, sheet CAN-CurrSense/COMP
CAN-EN: port CAN-EN, sheet CAN-CurrSense/EN
CAN-FAULT: B8.5(FAULT) R64.2 ; port CAN-FAULT
CAN-RX: B8.4(RXD) ; port CAN-RX
CAN-S: B8.8(S) ; port CAN-S
CAN-TX: B8.1(TXD) ; port CAN-TX
CAN_N: B8.6(CANL) R63.1 ; port CAN_N
CAN_P: B8.7(CANH) R62.1 ; port CAN_P
CAN_VSEN: R61.2 ; sheet CAN-CurrSense/VSENSE
NetC47_1: C47.1 R62.2 R63.2

### Layout directives
net class SupplyMin: 3V3-CAN, GND
differential pair: CAN_N, CAN_P

### Notes on the sheet
- CAN termination is placed in OBC's CAN1 and ADCS's CAN RX/TX
- CAN Transciever

### Library data of the parts
B8 = CMP-348-000000-1: CAN Interface IC; Manufacturer_Name: Texas Instruments; Geometry.Height: 1.75mm; Mouser Price/Stock: https://www.mouser.co.uk/ProductDetail/Texas-Instruments/TCAN337GD?qs=gMfM3zrbS4qmjQESf%252BTgJw%3D%3D; Mouser Part Number: 595-TCAN337GD; Manufacturer_Part_Number: TCAN337GD; Source: TCAN337GD.SchLib; Datasheet Link: https://www.arrow.com/en/products/tcan337gd/texas-instruments; Design Item ID: TCAN337GD
C47 = CMP-001-00119-3: ESD SMD Auto C0G, Ceramic, 4700 pF, 1%, 25 VDC, C0G, SMD, MLCC, Temperature Stable, Electro Static Discharge, Automotive Grade, 0603; Manufacturer_Name: Kemet; Manufacturer_Part_Number: C0603C472F3GECAUTO; Copyright: Copyright (C) 2026 Ultra Librarian. All rights reserved.; Design Item ID: C0603C472F3GECAUTO; Source: C0603C472F3GECAUTO.SchLib; Datasheet: https://content.kemet.com/datasheets/KEM_C1091_C0G_ESD.pdf
C48 = CMP-001-00117-3: SMD Auto X7R Flex, Ceramic, 1 uF, 5%, 16 VDC, X7R, SMD, MLCC, FT-CAP, Automotive Grade, 0603; Manufacturer_Name: Kemet; Design Item ID: C0603X105J4RACAUTO; Manufacturer_Part_Number: C0603X105J4RACAUTO; Source: C0603X105J4RACAUTO.SchLib; Copyright: Copyright (C) 2025 Ultra Librarian. All rights reserved.
C49 = CMP-001-00103-1: Multilayer Ceramic Capacitors MLCC - SMD/SMT 16V 0.1uF X7R 0603 5% Flex Soft; Dissipation Factor: 3.5%; Termination: SMD/SMT; Schedule B: 8532240020, 8532240020; Voltage Rating (DC): 16V; Case/Package: 0603; Width: 800µm; Mounting Technology: Surface Mount; Lifecycle Status: Production; RoHS: Compliant; Dielectric Material: Ceramic; Max Operating Temperature: 125°C; Voltage: 16V; China RoHS: Compliant; Dielectric: X7R; REACH SVHC: Yes; Voltage Rating: 16V; Min Operating Temperature: -55°C; Case Code (Imperial): 0603; Number of Terminals: 2; Case Code (Metric): 1608; Length: 1.6mm; Features: Soft Termination; Tolerance: 5%; Thickness: 863.6µm; Depth: 800µm; Height: 800µm
R61 = CMP-009-00270-1: 124 mOhms Â±1% 0.25W, 1/4W Chip Resistor 0603 (1608 Metric) Automotive AEC-Q200, Current Sense, Moisture Resistant Thick Film; MF: KOA Speer; SnapEDA_Link: https://www.snapeda.com/parts/SR731JTTDR124F/KOA+Speer/view-part/?ref=snap; Source: SR731JTTDR124F.SchLib; Pins: 2; Case/Package: 603 KOA; MP: SR731JTTDR124F; Design Item ID: SR731JTTDR124F; Check_prices: https://www.snapeda.com/parts/SR731JTTDR124F/KOA+Speer/view-part/?ref=eda; Component Type: Standard
R62 R63 = CMP-020-000000-1: Thin Film Resistors - SMD P 0603 Y 60R0 B B TR; Manufacturer_Name: Vishay; Geometry.Height: 0.63mm; Design Item ID: P0603Y60R0BBT; Datasheet Link: https://www.vishay.com/docs/53017/p.pdf; Mouser Part Number: *; Source: P0603Y60R0BBT.SchLib; Manufacturer_Part_Number: P0603Y60R0BBT; Mouser Price/Stock: *
R64 = CMP-009-00245-3: as R1 on sheet Complete circuit; Design Item ID: ERA3ARB103V; Case/Package: None; Pins: 2; Source: ERA3ARB103V.SchLib; Component Type: Standard; MP: ERA3ARB103V; Availability: Unavailable; Price: None

## Sheet CurrentSensing.SchDoc
size A4; SheetNumber: 3; SheetTotal: 9
Used 4 times, as channels CAN/CAN-CurrSense, SEN/IMU-CurrSense, SEN/MGN-CurrSense, MEM/MRAM-CurrSense. Parts and nets are listed once, with the designators drawn on the sheet.
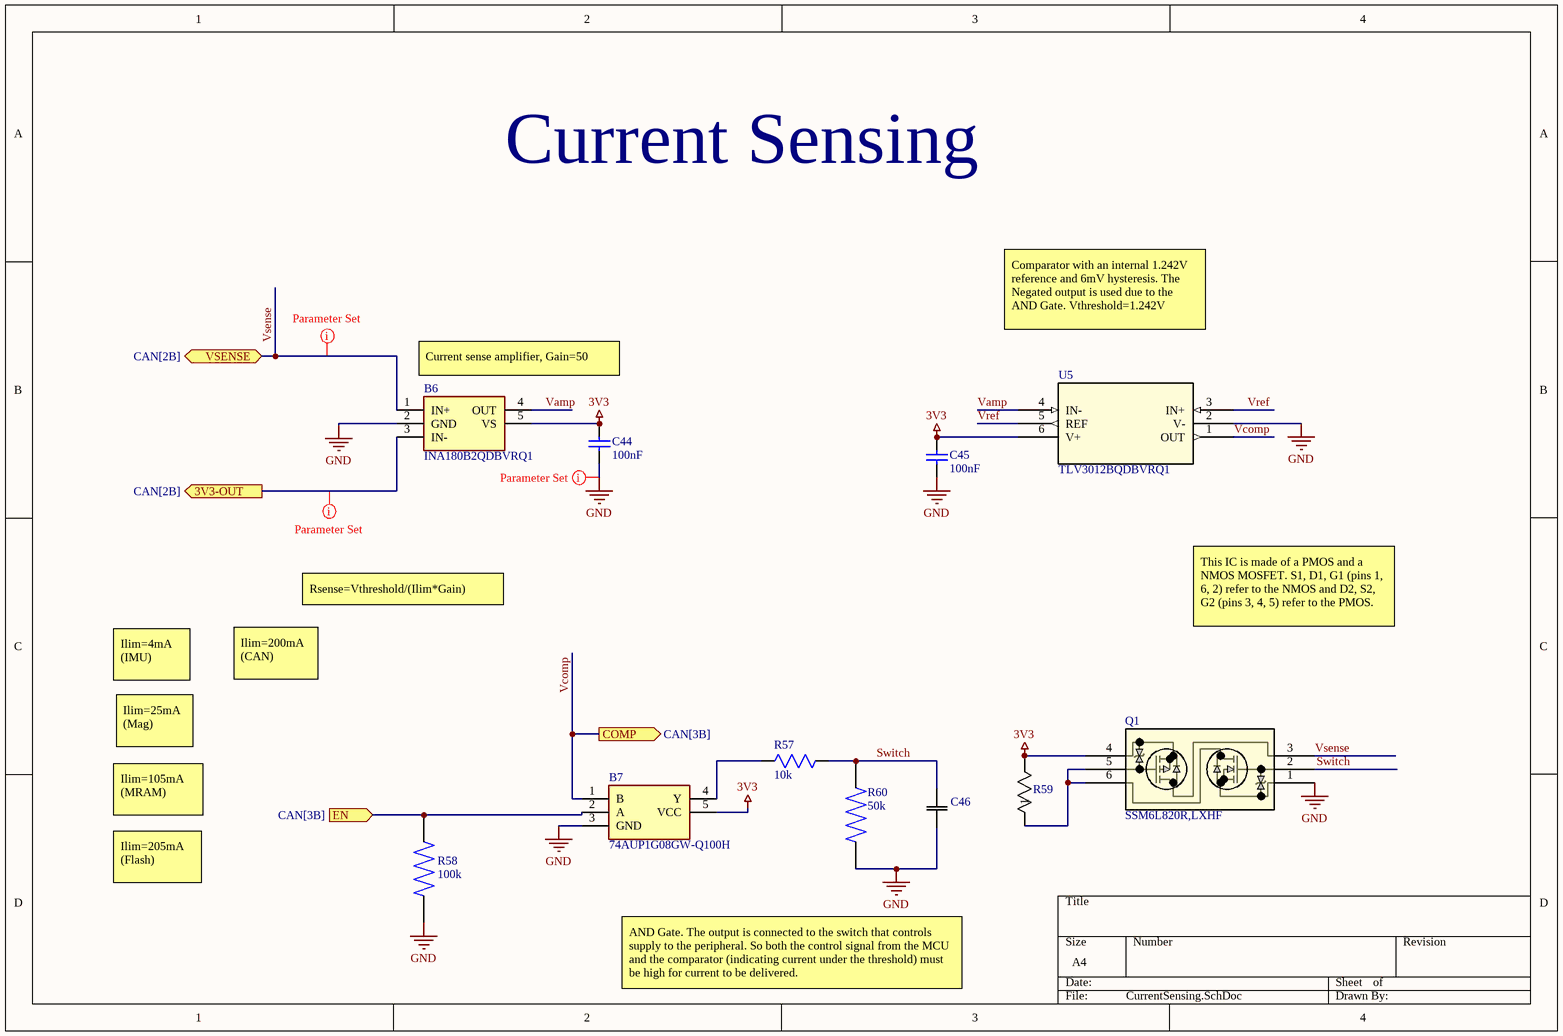
[diagram p4: CurrentSensing.SchDoc]

### Parts
B6  INA180B2QDBVRQ1  [SOT95P280X145-5N]
B7  74AUP1G08GW-Q100H  [SOT65P212X110-5N]
C44  value 100nF  [CAPC1608X87X45LL20T05]  (hidden comment: C0603X104J4RACTU)
C45  value 100nF  [CAPC1608X87X45LL20T05]  (hidden comment: C0603X104J4RACTU)
C46  C0603X103F3GACAUTO  [CAPC17795_95N_KEM]  (value not drawn)
Q1  SSM6L820R,LXHF  [TSOP6F_TOS]
R57  value 10k  [RES_ERA3ARB103V]  (hidden comment: ERA3ARB103V)
R58  value 100k  [RESC1608X50N]  (hidden comment: RG1608N-104-W-T1)
R59  CRCW060310K0DHEAP  [RC0603N_VIS]  (value not drawn)
R60  value 50k  [RESC1608X55N]  (hidden comment: TNPU060350K0HZEN00)
U5  TLV3012BQDBVRQ1  [SOT-23-6_DBV_TEX]

### Ports
3V3-OUT (out, see CAN[2B]), COMP (out, see CAN[3B]), EN (in, see CAN[3B]), VSENSE (bidir, see CAN[2B])

### Nets
3V3: B6.5(VS) B7.5(VCC) C44.1 C45.1 Q1.4 R59.2 U5.6(V+)
GND: B6.2(GND) B7.3(GND) C44.2 C45.2 C46.1 Q1.1 R58.1 R60.1 U5.2(V-)
3V3-OUT: B6.3(IN-) ; port 3V3-OUT
EN: B7.2(A) R58.2 ; port EN
Switch: C46.2 Q1.2 R57.1 R60.2
Vamp: B6.4(OUT) U5.4(IN-)
Vcomp: B7.1(B) U5.1(OUT) ; port COMP
Vref: U5.3(IN+) U5.5(REF)
Vsense: B6.1(IN+) Q1.3 ; port VSENSE
NetB7_4: B7.4(Y) R57.2
NetQ1_5: Q1.5 Q1.6 R59.1

### Channels
CAN/CAN-CurrSense: designators end in A; ports 3V3-OUT=3V3-CAN COMP=CAN-COMP EN=CAN-EN VSENSE=CAN_VSEN
SEN/IMU-CurrSense: designators end in C; ports 3V3-OUT=3V3-IMU COMP=IMU-COMP EN=IMU-EN VSENSE=IMU_VSEN
SEN/MGN-CurrSense: designators end in D; ports 3V3-OUT=3V3-MGN COMP=MGN-COMP EN=MGN-EN VSENSE=MGN_VSEN
MEM/MRAM-CurrSense: designators end in B; ports 3V3-OUT=3V3-MRAM COMP=MRAM-COMP EN=MRAM-EN VSENSE=MRAM-VSEN

### Layout directives
net class SupplyMin: 3V3-CAN, CAN_VSEN, GND

### Notes on the sheet
- Current Sensing
- (near B6) Current sense amplifier, Gain=50
- Comparator with an internal 1.242V reference and 6mV hysteresis. The Negated output is used due to the AND Gate. Vthreshold=1.242V
- Rsense=Vthreshold/(Ilim*Gain)
- This IC is made of a PMOS and a NMOS MOSFET. S1, D1, G1 (pins 1, 6, 2) refer to the NMOS and D2, S2, G2 (pins 3, 4, 5) refer to the PMOS.
- Ilim=4mA (IMU)
- Ilim=200mA (CAN)
- Ilim=25mA (Mag)
- Ilim=105mA (MRAM)
- Ilim=205mA (Flash)
- AND Gate. The output is connected to the switch that controls supply to the peripheral. So both the control signal from the MCU and the comparator (indicating current under the threshold) must be high for current to be delivered.

### Library data of the parts
B6 = CMP-014-00005-3: AEC-Q100, 26-V, low-/high-side, voltage output current sense amplifier; Manufacturer_Name: Texas Instruments; Geometry.Height: 1.45mm; Datasheet Link: http://www.ti.com/lit/gpn/INA180-Q1; Source: INA180B2QDBVRQ1.SchLib; Mouser Price/Stock: https://www.mouser.co.uk/ProductDetail/Texas-Instruments/INA180B2QDBVRQ1?qs=9r4v7xj2Lnm44%2Fgl%2FBjV6g%3D%3D; Manufacturer_Part_Number: INA180B2QDBVRQ1; Mouser Part Number: 595-INA180B2QDBVRQ1; Design Item ID: INA180B2QDBVRQ1
B7 = CMP-218-000000-3: 74AUP1G08-Q100 - Low-power 2-input AND gate@en-us; Manufacturer_Name: Nexperia; Geometry.Height: 1.1mm; Mouser Part Number: 771-74AUP1G08GWQ100H; Manufacturer_Part_Number: 74AUP1G08GW-Q100H; Design Item ID: 74AUP1G08GW-Q100H; Datasheet Link: https://assets.nexperia.com/documents/data-sheet/74AUP1G08_Q100.pdf; Source: 74AUP1G08GW-Q100H.SchLib; Mouser Price/Stock: https://www.mouser.co.uk/ProductDetail/Nexperia/74AUP1G08GW-Q100H?qs=5XOdhvmYM0Mwp8ByWVd8CQ%3D%3D
C44 C45 = CMP-001-00103-1: as C49 on sheet CAN; Termination: SMD/SMT; Schedule B: 8532240020, 8532240020; Voltage Rating (DC): 16V; Case/Package: 0603; Width: 800µm; Mounting Technology: Surface Mount; Lifecycle Status: Production; RoHS: Compliant; Dielectric Material: Ceramic; Max Operating Temperature: 125°C; Voltage: 16V; China RoHS: Compliant; Dielectric: X7R; REACH SVHC: Yes; Voltage Rating: 16V; Min Operating Temperature: -55°C; Case Code (Imperial): 0603; Number of Terminals: 2; Case Code (Metric): 1608; Length: 1.6mm; Features: Soft Termination; Tolerance: 5%; Thickness: 863.6µm; Depth: 800µm; Height: 800µm
C46 = CMP-001-00116-2: as C11 on sheet Complete circuit; Copyright: Copyright (C) 2025 Ultra Librarian. All rights reserved.; Design Item ID: C0603X103F3GACAUTO; Manufacturer_Part_Number: C0603X103F3GACAUTO; Source: C0603X103F3GACAUTO.SchLib
Q1 = CMP-382-000000-1: N-ch + P-ch MOSFET, 30 V/-20 V, 4 A/-4 A, 0.0391 Î©@4.5V/0.045 Î©@10V, TSOP6F; Manufacturer_Name: Toshiba Electronic Devices & Storage Corp.; Datasheet: https://toshiba.semicon-storage.com/info/docget.jsp?did=63678&prodName=SSM6L820R; Type: Type; Design Item ID: SSM6L820R,LXHF; Copyright: Copyright (C) 2026 Ultra Librarian. All rights reserved.; RefDes: RefDes; Manufacturer_Part_Number: SSM6L820R,LXHF; Source: SSM6L820R,LXHF.SchLib
R57 = CMP-009-00245-3: as R1 on sheet Complete circuit; Design Item ID: ERA3ARB103V; Case/Package: None; Pins: 2; Source: ERA3ARB103V.SchLib; Component Type: Standard; MP: ERA3ARB103V; Availability: Unavailable; Price: None
R58 = CMP-009-00274-1: 100 kOhms Â±0.05% 0.1W, 1/10W Chip Resistor 0603 (1608 Metric) Anti-Sulfur, Automotive AEC-Q200 Thin Film; MF: Susumu; Pins: 2; Case/Package: 1608 Susumu; Design Item ID: RG1608N-104-W-T1; Component Type: Standard; MP: RG1608N-104-W-T1; Check_prices: https://www.snapeda.com/parts/RG1608N-104-W-T1/Susumu/view-part/?ref=eda; SnapEDA_Link: https://www.snapeda.com/parts/RG1608N-104-W-T1/Susumu/view-part/?ref=snap; Source: RG1608N-104-W-T1.SchLib
R59 = CMP-009-00226-2: D11/CRCW0603-P 50 10K 0.5% ET1 e3; Manufacturer_Name: Vishay; Manufacturer_Part_Number: CRCW060310K0DHEAP; Copyright: Copyright (C) 2026 Ultra Librarian. All rights reserved.; Datasheet: https://www.vishay.com/doc?20036; Design Item ID: CRCW060310K0DHEAP; Source: CRCW060310K0DHEAP.SchLib
R60 = CMP-009-00220-1: 50 kOhms Â±0.02% 0.1W, 1/10W Chip Resistor 0603 (1608 Metric) Anti-Sulfur, Automotive AEC-Q200, Moisture Resistant Thin Film; MF: Vishay; Check_prices: https://www.snapeda.com/parts/TNPU060350K0HZEN00/Vishay/view-part/?ref=eda; SnapEDA_Link: https://www.snapeda.com/parts/TNPU060350K0HZEN00/Vishay/view-part/?ref=snap; Component Type: Standard; Design Item ID: TNPU060350K0HZEN00; Source: TNPU060350K0HZEN00.SchLib; MP: TNPU060350K0HZEN00; Case/Package: 1608 Vishay; Pins: 2
U5 = CMP-031-00019-1: Automotive micropower comparator with integrated reference pin and push-pull output 6-SOT-23 -40 to 125; Manufacturer_Name: Texas Instruments; Datasheet: https://www.ti.com/lit/gpn/tlv3012b-q1; Design Item ID: TLV3012BQDBVRQ1; Copyright: Copyright (C) 2026 Ultra Librarian. All rights reserved.; Manufacturer_Part_Number: TLV3012BQDBVRQ1; Type: Linear; RefDes: RefDes; Source: TLV3012BQDBVRQ1.SchLib

## Sheet Sensors.SchDoc
size A4; SheetNumber: 2; SheetTotal: 9
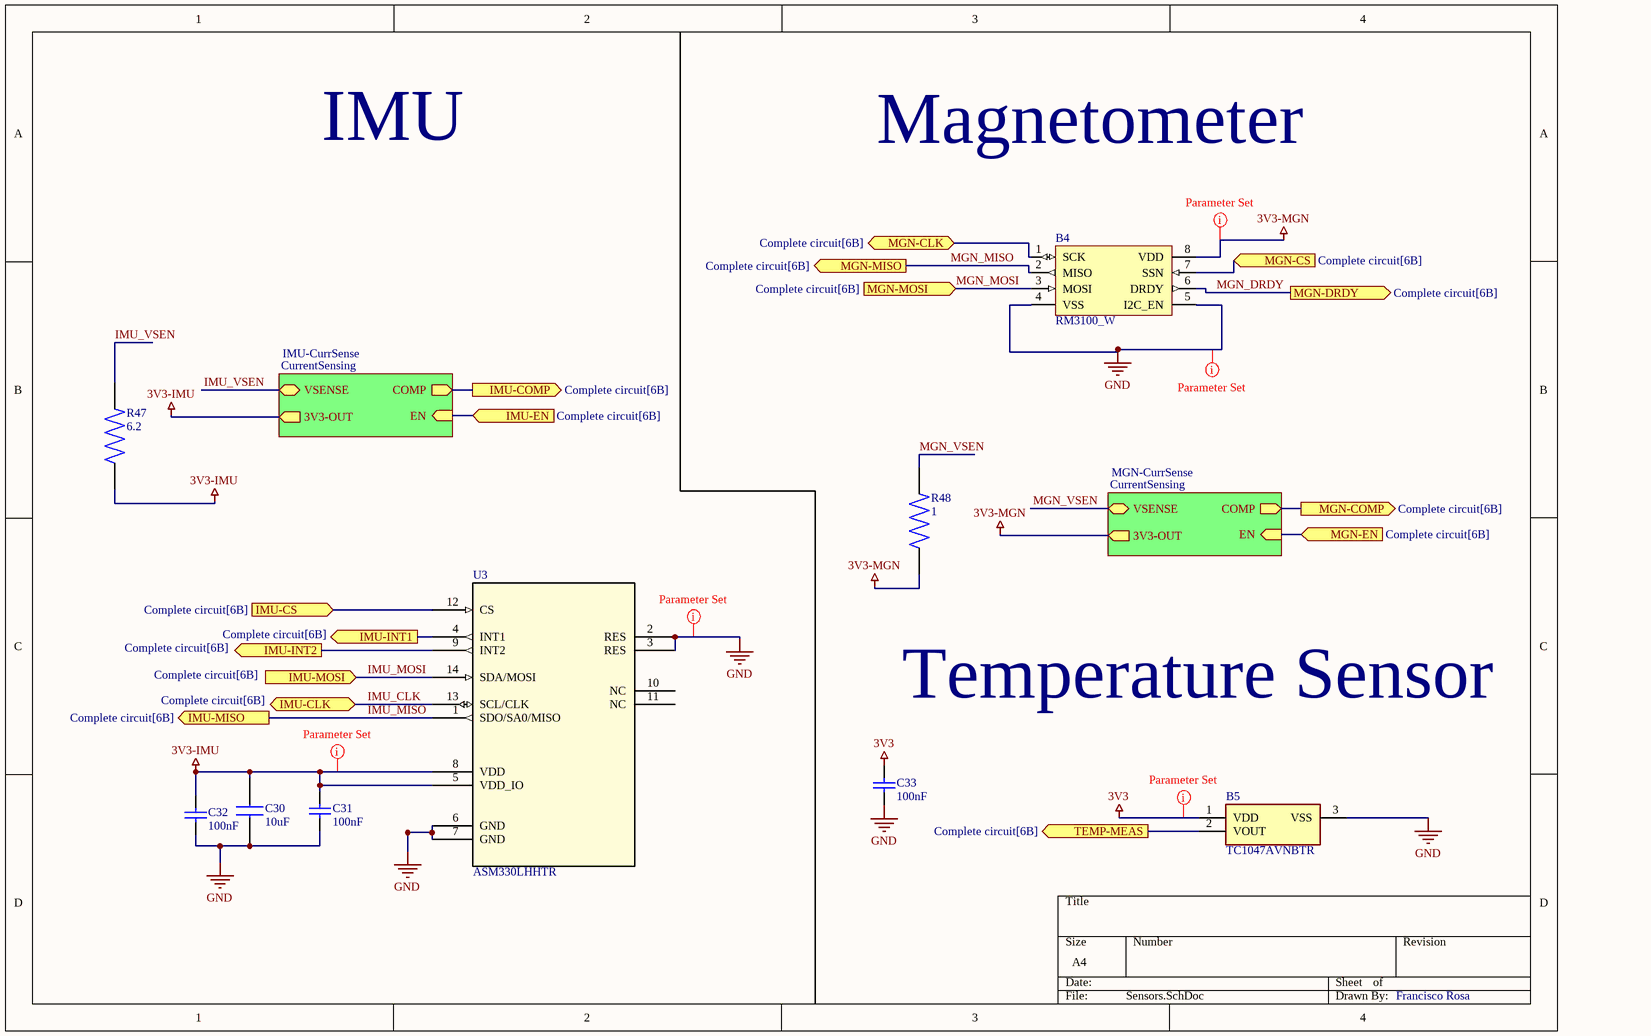
[diagram p5: Sensors.SchDoc]

### Parts
B4  RM3100_W  [RM3100_W]
B5  TC1047AVNBTR  [SOT96P237X112-3N]
C30  Capacitance: 10uF  [CAPC2012X145N]  (hidden comment: C0805X106K8RACAUTO7210)
C31  value 100nF  [CAPC1608X87X45LL20T05]  (hidden comment: C0603X104J4RACTU)
C32  value 100nF  [CAPC1608X87X45LL20T05]  (hidden comment: C0603X104J4RACTU)
C33  value 100nF  [CAPC1608X87X45LL20T05]  (hidden comment: C0603X104J4RACTU)
R47  value 6.2  [RES_ERJ3BQF6R2V]  (hidden comment: ERJ3BQF6R2V)
R48  value 1  [RES_ERJ3BQF1R0V]  (hidden comment: ERJ3BQF1R0V)
U3  ASM330LHHTR  [LGA-14L_2P5X3X0P83_STM]

### Sub-sheets
IMU-CurrSense = CurrentSensing: VSENSE (bidir), COMP (out), EN (in), 3V3-OUT (out)
MGN-CurrSense = CurrentSensing: VSENSE (bidir), 3V3-OUT (out), COMP (out), EN (in)

### Ports
IMU-CLK (bidir, see Complete circuit[6B]), IMU-COMP (out, see Complete circuit[6B]), IMU-CS (in, see Complete circuit[6B]), IMU-EN (in, see Complete circuit[6B]), IMU-INT1 (out, see Complete circuit[6B]), IMU-INT2 (out, see Complete circuit[6B]), IMU-MISO (out, see Complete circuit[6B]), IMU-MOSI (in, see Complete circuit[6B]), MGN-CLK (bidir, see Complete circuit[6B]), MGN-COMP (out, see Complete circuit[6B]), MGN-CS (in, see Complete circuit[6B]), MGN-DRDY (out, see Complete circuit[6B]), MGN-EN (in, see Complete circuit[6B]), MGN-MISO (out, see Complete circuit[6B]), MGN-MOSI (in, see Complete circuit[6B]), TEMP-MEAS (out, see Complete circuit[6B])

### Nets
3V3: B5.1(VDD) C33.1  [project net VDD]
3V3-IMU: C30.2 C31.1 C32.1 R47.1 U3.5(VDD_IO) U3.8(VDD) ; sheet IMU-CurrSense/3V3-OUT
3V3-MGN: B4.8(VDD) R48.1 ; sheet MGN-CurrSense/3V3-OUT
GND: B4.4(VSS) B4.5(I2C_EN) B5.3(VSS) C30.1 C31.2 C32.2 C33.2 U3.2(RES) U3.3(RES) U3.6(GND) U3.7(GND)
MGN-CLK: B4.1(SCK) ; port MGN-CLK
IMU-COMP: port IMU-COMP, sheet IMU-CurrSense/COMP
IMU-CS: U3.12(CS) ; port IMU-CS
IMU-EN: port IMU-EN, sheet IMU-CurrSense/EN
IMU-INT1: U3.4(INT1) ; port IMU-INT1
IMU-INT2: U3.9(INT2) ; port IMU-INT2
IMU_CLK: U3.13(SCL/CLK) ; port IMU-CLK  [project net IMU-CLK]
IMU_MISO: U3.1(SDO/SA0/MISO) ; port IMU-MISO  [project net IMU-MISO]
IMU_MOSI: U3.14(SDA/MOSI) ; port IMU-MOSI  [project net IMU-MOSI]
IMU_VSEN: R47.2 ; sheet IMU-CurrSense/VSENSE
MGN-COMP: port MGN-COMP, sheet MGN-CurrSense/COMP
MGN-CS: B4.7(SSN) ; port MGN-CS
MGN-EN: port MGN-EN, sheet MGN-CurrSense/EN
MGN_DRDY: B4.6(DRDY) ; port MGN-DRDY
MGN_MISO: B4.2(MISO) ; port MGN-MISO  [project net MGN-MISO]
MGN_MOSI: B4.3(MOSI) ; port MGN-MOSI  [project net MGN-MOSI]
MGN_VSEN: R48.2 ; sheet MGN-CurrSense/VSENSE
TEMP-MEAS: B5.2(VOUT) ; port TEMP-MEAS

Not connected (* = marked no-connect by the designer): U3 10(NC) 11(NC)

### Layout directives
net class SupplyMin: 3V3-IMU, 3V3-MGN, GND, VDD

### Notes on the sheet
- IMU
- Magnetometer
- Temperature Sensor
- Francisco Rosa

### Library data of the parts
B4 = CMP-398-000000-3: Compact Board-Mounted Magnetometer; Design Item ID: RM3100_W; Source: RM3100-CB.SchLib
B5 = CMP-226-000000-1: Temperature to Voltage Converter; Manufacturer_Name: Microchip; Geometry.Height: 1.12mm; Datasheet Link: https://datasheet.datasheetarchive.com/originals/distributors/Datasheets-304/55284.pdf; Mouser Part Number: 579-TC1047AVNBTR; Source: TC1047AVNBTR.SchLib; Design Item ID: TC1047AVNBTR; Mouser Price/Stock: https://www.mouser.co.uk/ProductDetail/Microchip-Technology/TC1047AVNBTR?qs=RnzODY3cU8tj%252BFOzpvF4Qg%3D%3D; Manufacturer_Part_Number: TC1047AVNBTR
C30 = CMP-001-00121-2: SMD Auto X7R Flex, Ceramic, 10 uF, 10%, 10 VDC, 25 VDC, 125C, -55C, X7R, SMD, MLCC, FT-CAP, Automotive Grade, 10 % , 10 MOhms, 21 mg, 0805, 2mm, 1.25mm, 1.25mm, 0.75mm, 0.5mm, 10000, 78  Weeks, 80; Manufacturer_Name: YAGEO; Geometry.Height: 1.45mm; Mouser Price/Stock: https://www.mouser.co.uk/ProductDetail/KEMET/C0805X106K8RACAUTO7210?qs=HXFqYaX1Q2whBpVr4Bdd3g%3D%3D; Mouser Part Number: 80-C0805X106K8RAUTLR; Source: C0805X106K8RACAUTO7210.SchLib; Design Item ID: C0805X106K8RACAUTO7210; Datasheet Link: https://content.kemet.com/datasheets/KEM_C1078_X7R_FT-CAP_AUTO_SMD.pdf; Manufacturer_Part_Number: C0805X106K8RACAUTO7210
C31-C33 = CMP-001-00103-1: as C49 on sheet CAN; Termination: SMD/SMT; Schedule B: 8532240020, 8532240020; Voltage Rating (DC): 16V; Case/Package: 0603; Width: 800µm; Mounting Technology: Surface Mount; Lifecycle Status: Production; RoHS: Compliant; Dielectric Material: Ceramic; Max Operating Temperature: 125°C; Voltage: 16V; China RoHS: Compliant; Dielectric: X7R; REACH SVHC: Yes; Voltage Rating: 16V; Min Operating Temperature: -55°C; Case Code (Imperial): 0603; Number of Terminals: 2; Case Code (Metric): 1608; Length: 1.6mm; Features: Soft Termination; Tolerance: 5%; Thickness: 863.6µm; Depth: 800µm; Height: 800µm
R47 = CMP-009-00272-1: Thick Film Low Ohmic Smnt Resistor 0603 Case 6.2Ohm +/-1%.2W +/-200ppm/C; MF: Panasonic; Design Item ID: ERJ3BQF6R2V; Source: ERJ3BQF6R2V.SchLib; Case/Package: 1608-2 Panasonic; MP: ERJ3BQF6R2V; SnapEDA_Link: https://www.snapeda.com/parts/ERJ3BQF6R2V/Panasonic/view-part/?ref=snap; Component Type: Standard; Pins: 2; Check_prices: https://www.snapeda.com/parts/ERJ3BQF6R2V/Panasonic/view-part/?ref=eda
R48 = CMP-009-00271-1: Thick Film Low Ohmic Smnt Resistor 0603 Case 1Ohm +/-1% 0.2W +/-200ppm/degC; MF: Panasonic; Source: ERJ3BQF1R0V.SchLib; Case/Package: 1608-2 Panasonic; Design Item ID: ERJ3BQF1R0V; Component Type: Standard; SnapEDA_Link: https://www.snapeda.com/parts/ERJ3BQF1R0V/Panasonic/view-part/?ref=snap; Check_prices: https://www.snapeda.com/parts/ERJ3BQF1R0V/Panasonic/view-part/?ref=eda; Pins: 2; MP: ERJ3BQF1R0V
U3 = CMP-405-000000-3: Automotive 6-axis IMU (inertial measurement unit): 3-axis accelerometer and 3-axis gyroscope; Manufacturer_Name: STMicroelectronics; Source: ASM330LHHTR.SchLib; Copyright: Copyright (C) 2025 Ultra Librarian. All rights reserved.; Type: Type; RefDes: RefDes; Manufacturer_Part_Number: ASM330LHHTR; Design Item ID: ASM330LHHTR

## Sheet Conversion5V.SchDoc
size A4; SheetNumber: 9; SheetTotal: 9
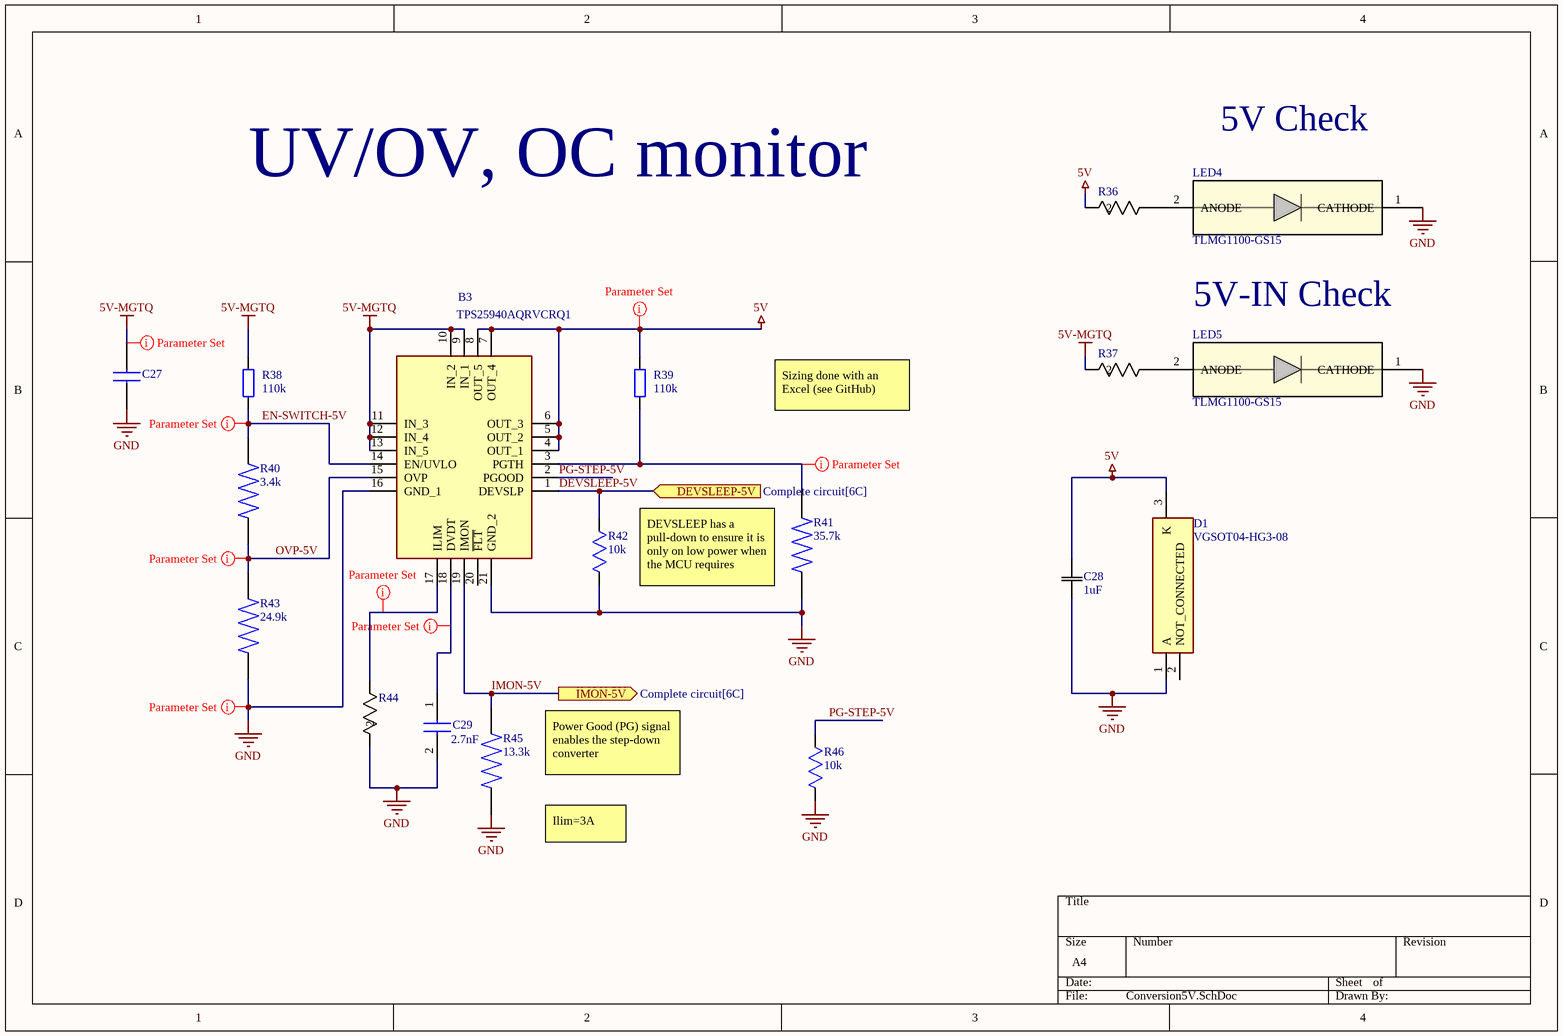
[diagram p6: Conversion5V.SchDoc]

### Parts
B3  TPS25940AQRVCRQ1  [QFN50P300X400X80-21N]
C27  C1206C104K3GACAUTO  [CAPC3216X180N]  (value not drawn)
C28  Capacitance: 1uF  [CAPC18095_95N_KEM]  (hidden comment: C0603X105J4RACAUTO)
C29  Capacitance: 2.7nF  [GCM188]  (hidden comment: GCM1885C1H272FA16J)
D1  VGSOT04-HG3-08  [SOT95P242X112-3N]
LED4  TLMG1100-GS15  [LED_0603_VIS]
LED5  TLMG1100-GS15  [LED_0603_VIS]
R36  MCT0603MD7502BP100  [RES_MCT_0603_VIS]  (value not drawn)
R37  MCT0603MD7502BP100  [RES_MCT_0603_VIS]  (value not drawn)
R38  value 110k  [WRIS-RSKS_0603_Reflow]  (hidden comment: 560112116148)
R39  value 110k  [WRIS-RSKS_0603_Reflow]  (hidden comment: 560112116148)
R40  value 3.4k  [RESC1508X60N]  (hidden comment: RQ73C1J3K4BTD)
R41  value 35.7k  [RESC1508X50N]  (hidden comment: RNCP0603FTD35K7)
R42  value 10k  [RES_ERA3ARB103V]  (hidden comment: ERA3ARB103V)
R43  value 24.9k  [RESC1508X50N]  (hidden comment: RNCP0603FTD24K9)
R44  CRCW060330K1FKEAHP  [RES_CRCW_0603_VIS]  (value not drawn)
R45  value 13.3k  [RESC1608X55N]  (hidden comment: CRCW060313K3FKEAHP)
R46  value 10k  [RES_ERA3ARB103V]  (hidden comment: ERA3ARB103V)

### Ports
DEVSLEEP-5V (in, see Complete circuit[6C]), IMON-5V (out, see Complete circuit[6C])

### Nets
5V: B3.4(OUT_1) B3.5(OUT_2) B3.6(OUT_3) B3.7(OUT_4) B3.8(OUT_5) C28.2 D1.3(K) R36.2 R39.1
5V-MGTQ: B3.9(IN_1) B3.10(IN_2) B3.11(IN_3) B3.12(IN_4) B3.13(IN_5) C27.1 R37.2 R38.1
GND: B3.16(GND_1) B3.21(GND_2) C27.2 C28.1 C29.2 D1.1(A) LED4.1(CATHODE) LED5.1(CATHODE) R41.1 R42.1 R43.1 R44.2 R45.1 R46.1
DEVSLEEP-5V: B3.1(DEVSLP) R42.2 ; port DEVSLEEP-5V
EN-SWITCH-5V: B3.14(EN/UVLO) R38.2 R40.2
IMON-5V: B3.19(IMON) R45.2 ; port IMON-5V
OVP-5V: B3.15(OVP) R40.1 R43.2
PG-STEP-5V: B3.2(PGOOD) R46.2
NetB3_3: B3.3(PGTH) R39.2 R41.2
NetB3_17: B3.17(ILIM) R44.1
NetB3_18: B3.18(DVDT) C29.1
NetLED4_2: LED4.2(ANODE) R36.1
NetLED5_2: LED5.2(ANODE) R37.1

Not connected (* = marked no-connect by the designer): B3 20(~{FLT}); D1 2(NOT_CONNECTED)

### Layout directives
net class SupplyMax: 5V-MGTQ
net class SupplyMin: 5V, EN-SWITCH-5V, GND, NetB3_3, NetB3_17, NetB3_18, OVP-5V

### Notes on the sheet
- 5V Check
- UV/OV, OC monitor
- 5V-IN Check
- Sizing done with an Excel (see GitHub)
- DEVSLEEP has a pull-down to ensure it is only on low power when the MCU requires
- Power Good (PG) signal enables the step-down converter
- Ilim=3A

### Library data of the parts
B3 = CMP-011-00016-1: 2.7V-18V Automotive Current-Limited Load Switch with Current Sense & Short-to-Battery Protection; Manufacturer_Name: Texas Instruments; Geometry.Height: 0.8mm; Source: TPS25940AQRVCRQ1.SchLib; Datasheet Link: http://www.ti.com/lit/gpn/tps25940-q1; Design Item ID: TPS25940AQRVCRQ1; Mouser Price/Stock: https://www.mouser.co.uk/ProductDetail/Texas-Instruments/TPS25940AQRVCRQ1?qs=osPbIpHqQ9Uam0Tf4VM8lQ%3D%3D; Mouser Part Number: 595-TPS25940AQRVCRQ1; Manufacturer_Part_Number: TPS25940AQRVCRQ1
C27 = CMP-001-00115-2: as C1 on sheet Complete circuit; Design Item ID: C1206C104K3GACAUTO; Manufacturer_Part_Number: C1206C104K3GACAUTO; Source: C1206C104K3GACAUTO.SchLib; Datasheet Link: https://content.kemet.com/datasheets/KEM_C1022_C0G_AUTO_SMD.pdf; Mouser Part Number: 80-C1206C104K3GAUTO; Mouser Price/Stock: https://www.mouser.co.uk/ProductDetail/KEMET/C1206C104K3GACAUTO?qs=iLbezkQI%252BsiL409OZdKKSA%3D%3D
C28 = CMP-001-00117-3: as C48 on sheet CAN; Copyright: Copyright (C) 2025 Ultra Librarian. All rights reserved.; Source: C0603X105J4RACAUTO.SchLib; Manufacturer_Part_Number: C0603X105J4RACAUTO; Design Item ID: C0603X105J4RACAUTO
C29 = GCM1885C1H272FA16J: Multilayer Ceramic Capacitors MLCC - SMD/SMT 2700 pF 50 VDC 1% 0603 C0G (NP0) AEC-Q200; Manufacturer_Name: Murata Electronics; Datasheet Link: https://search.murata.co.jp/Ceramy/image/img/A01X/G101/ENG/GCM1885C1H272FA16-01A.pdf; Height: 0.9mm; Manufacturer_Part_Number: GCM1885C1H272FA16J
D1 = VGSOT04-HG3-08: Diode ESD (Uni-directional); Manufacturer_Name: Vishay; Datasheet Link: https://www.vishay.com/docs/86326/vgsot03-vgsot36.pdf; Height: 1.12mm; Manufacturer_Part_Number: VGSOT04-HG3-08
LED4 LED5 = CMP-007-00036-1: as LED1 on sheet Complete circuit; RefDes: RefDes; Copyright: Copyright (C) 2025 Ultra Librarian. All rights reserved.; Type: Type; Design Item ID: TLMG1100-GS15; Manufacturer_Part_Number: TLMG1100-GS15; Source: TLMG1100-GS15.SchLib
R36 R37 = CMP-009-00216-2: as R3 on sheet Complete circuit; Source: MCT0603MD7502BP100.SchLib; Copyright: Copyright (C) 2025 Ultra Librarian. All rights reserved.; Design Item ID: MCT0603MD7502BP100; Manufacturer_Part_Number: MCT0603MD7502BP100
R38 R39 = CMP-009-00240-1: WRIS-RSKS Thick Film Resistor, size 0603, 110kO, +/-1%, 100mW; Manufacturer: Wurth Elektronik; Temperature Coefficient of Resistance Min: -100ppm/°C; Temperature Coefficient of Resistance Max: 100ppm/°C; Limiting Element Voltage: 75V; Length: 1.6mm; Rated Power: 100mW; Category: Thick Film Resistors; Resistance Tolerance: +/-1%; Source: WRIS-RSKS.SchLib; Height: 0.45mm; Case/Package: 0603; ComponentLink2Description: Datasheet Link; Match Code: WRIS-RSKS; Mount: Surface Mount; Width: 0.8mm; Packaging: Tape and Reel; Component Type: Standard; ComponentLink1URL: https://www.we-online.com/redexpert/article/560112116148?ad; Min Operating Temperature: -55°C; Design Item ID: 560112116148; Max Operating Temperature: 155°C; ComponentLink2URL: https://www.we-online.com/redexpert/spec/560112116148?ad; Pins: 2; ComponentLink1Description: Website Link; Manufacturer Part Number: 560112116148
R40 = CMP-009-00210-1: MP: RQ73C1J3K4BTD; Pins: 2; Source: RQ73C1J3K4BTD.SchLib; Price: None; Availability: Unavailable; Design Item ID: RQ73C1J3K4BTD; Component Type: Standard; Case/Package: None
R41 = CMP-009-00242-1: Res Thin Film 0603 35.7K Ohm 1% 0.125W(1/8W) Â±100ppm/C Sulfur Resistant Molded SMD Paper T/R; MF: Stackpole Electronics Inc; Case/Package: 1508 Stackpole; Component Type: Standard; Pins: 2; Design Item ID: RNCP0603FTD35K7; Check_prices: https://www.snapeda.com/parts/RNCP0603FTD35K7/Stackpole+Electronics/view-part/?ref=eda; Source: RNCP0603FTD35K7.SchLib; MP: RNCP0603FTD35K7; SnapEDA_Link: https://www.snapeda.com/parts/RNCP0603FTD35K7/Stackpole+Electronics/view-part/?ref=snap
R42 R46 = CMP-009-00245-3: as R1 on sheet Complete circuit; Design Item ID: ERA3ARB103V; Case/Package: None; Pins: 2; Source: ERA3ARB103V.SchLib; Component Type: Standard; MP: ERA3ARB103V; Availability: Unavailable; Price: None
R43 = CMP-009-00241-1: Res Thin Film 0603 24.9K Ohm 1% 0.125W(1/8W) Â±100ppm/C Sulfur Resistant Pad SMD T/R; MF: Stackpole Electronics Inc; Pins: 2; Case/Package: 1508 Stackpole; MP: RNCP0603FTD24K9; SnapEDA_Link: https://www.snapeda.com/parts/RNCP0603FTD24K9/Stackpole+Electronics/view-part/?ref=snap; Design Item ID: RNCP0603FTD24K9; Source: RNCP0603FTD24K9.SchLib; Component Type: Standard; Check_prices: https://www.snapeda.com/parts/RNCP0603FTD24K9/Stackpole+Electronics/view-part/?ref=eda
R44 = CMP-009-00263-3: 30.1 kOhms ±1% 0.333W, 1/3W Chip Resistor 0603 (1608 Metric) Automotive AEC-Q200, Pulse Withstanding Thick Film; Manufacturer_Name: Vishay; Resistance: 30.1k; Datasheet: https://www.vishay.com/doc?20043; Design Item ID: CRCW060330K1FKEAHP; Source: CRCW060330K1FKEAHP.SchLib; Copyright: Copyright (C) 2026 Ultra Librarian. All rights reserved.; Manufacturer_Part_Number: CRCW060330K1FKEAHP
R45 = CMP-009-00260-1: 13.3 kOhms Â±1% 0.333W, 1/3W Chip Resistor 0603 (1608 Metric) Automotive AEC-Q200, Pulse Withstanding Thick Film; MF: Vishay; Source: CRCW060313K3FKEAHP.SchLib; Component Type: Standard; Case/Package: 1608 Vishay; SnapEDA_Link: https://www.snapeda.com/parts/CRCW060313K3FKEAHP/Vishay/view-part/?ref=snap; MP: CRCW060313K3FKEAHP; Design Item ID: CRCW060313K3FKEAHP; Pins: 2; Check_prices: https://www.snapeda.com/parts/CRCW060313K3FKEAHP/Vishay/view-part/?ref=eda